# EasyEDA Pro project EdgeFouce_云台及电源管理.eprj, schematic Schematic1, sheets 1 to 4 of 5

## Sheets
1 STM32G431RBT6外围电路: Board Name: Board1; Create Date: 2026-06-02; Page Name: STM32G431RBT6外围电路; Project Name: EdgeFouce_云台及电源管理; Schematic Name: Schematic1; Update Date: 2026-06-02; Company: 嘉立创EDA; Page Size: A3; Version: V1.0
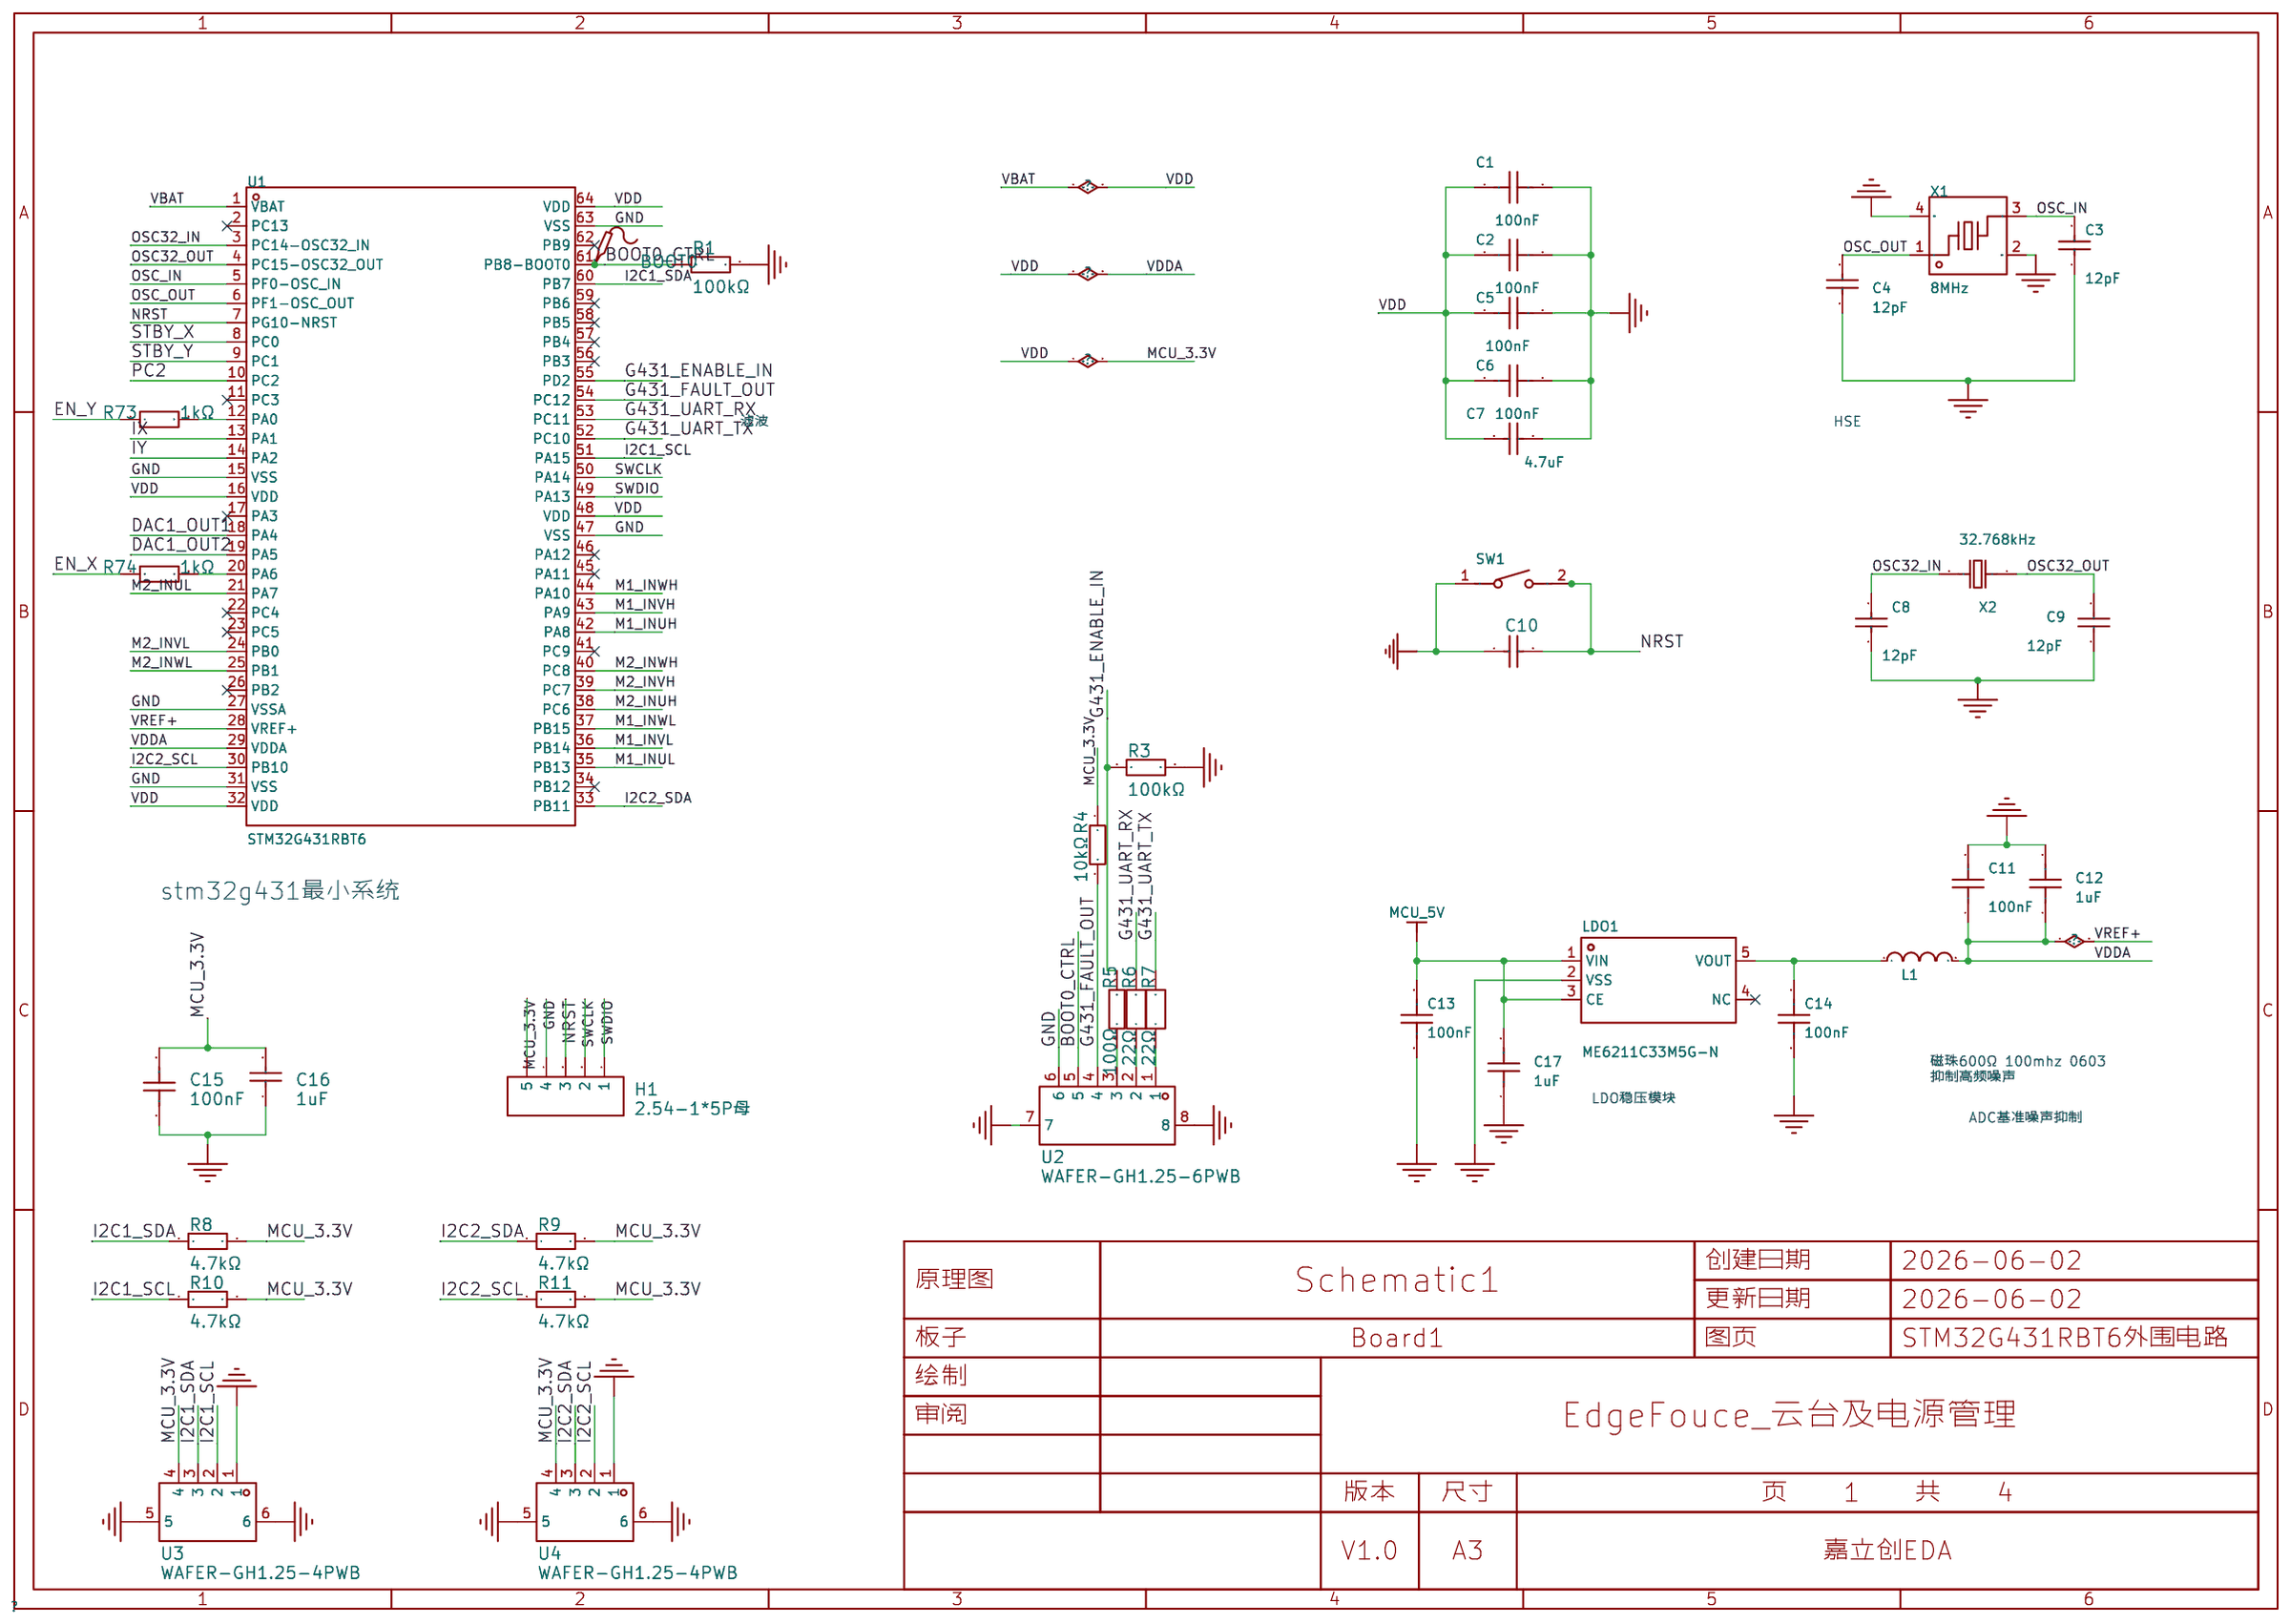
[diagram p0: STM32G431RBT6外围电路]
2 STPIN830电机驱动电路: Page Name: STPIN830电机驱动电路
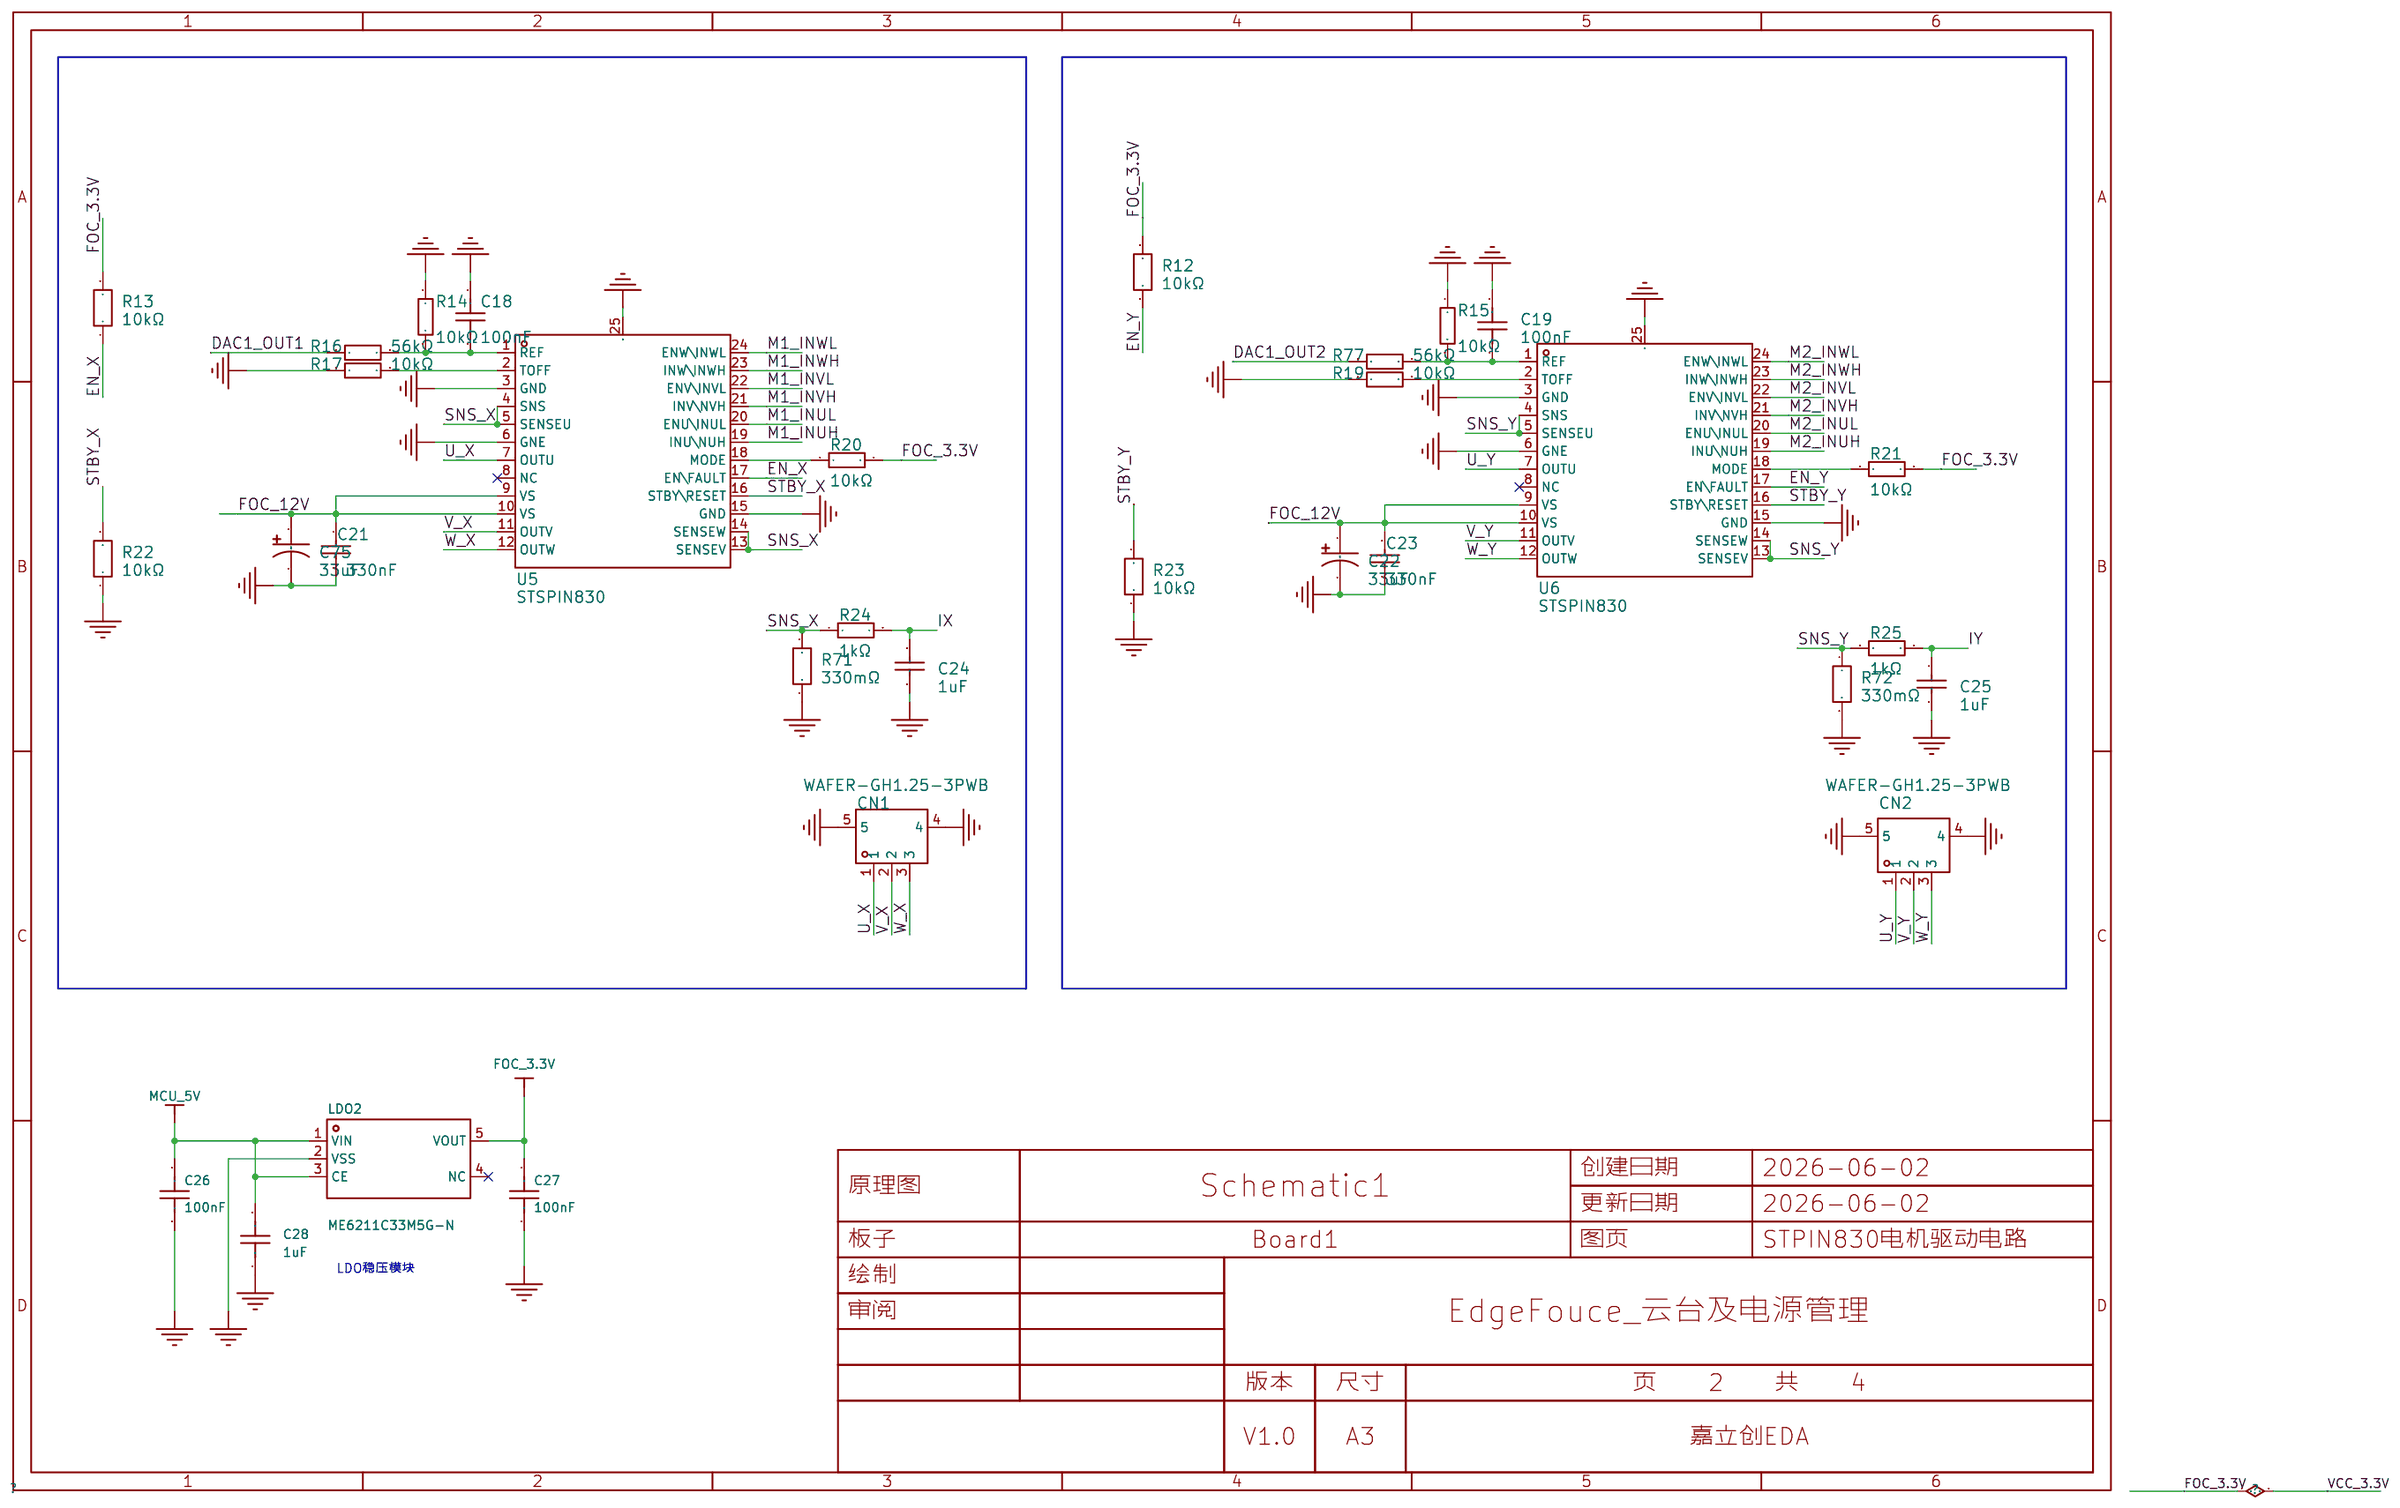
[diagram p1: STPIN830电机驱动电路]
3 PD取电: Page Name: PD取电
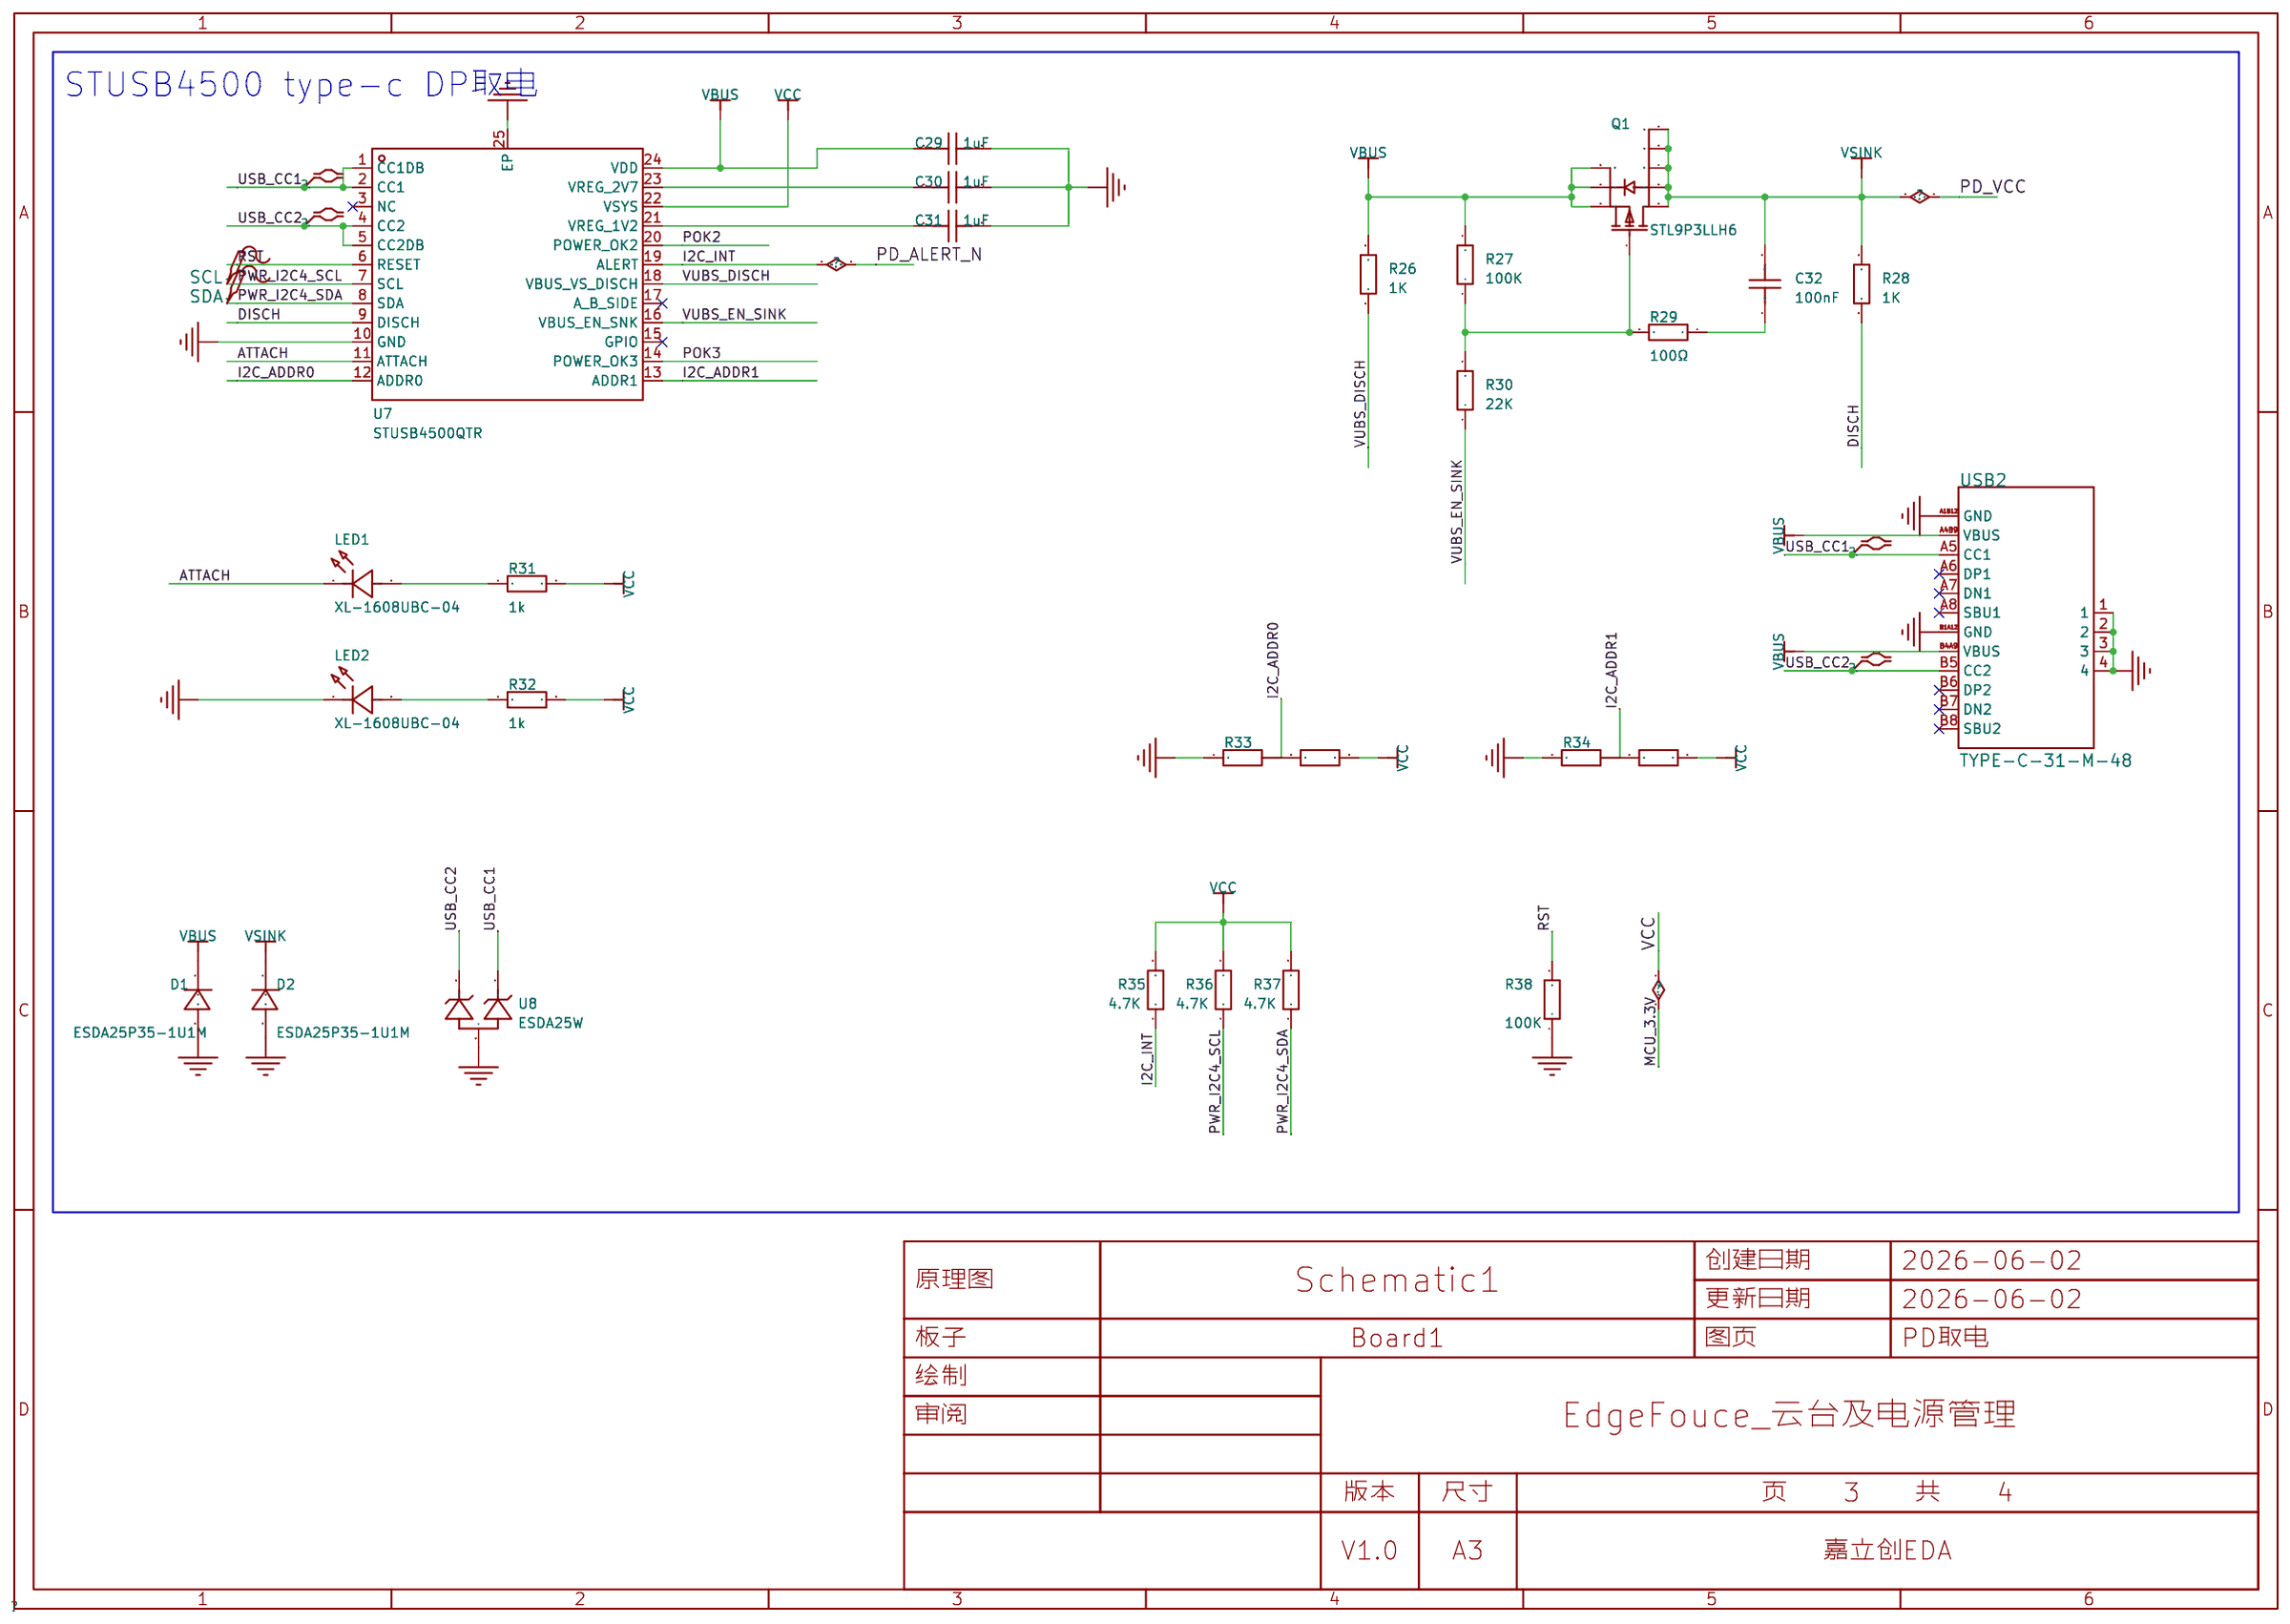
[diagram p2: PD取电]
4 充电及电源: Page Name: 充电及电源切换
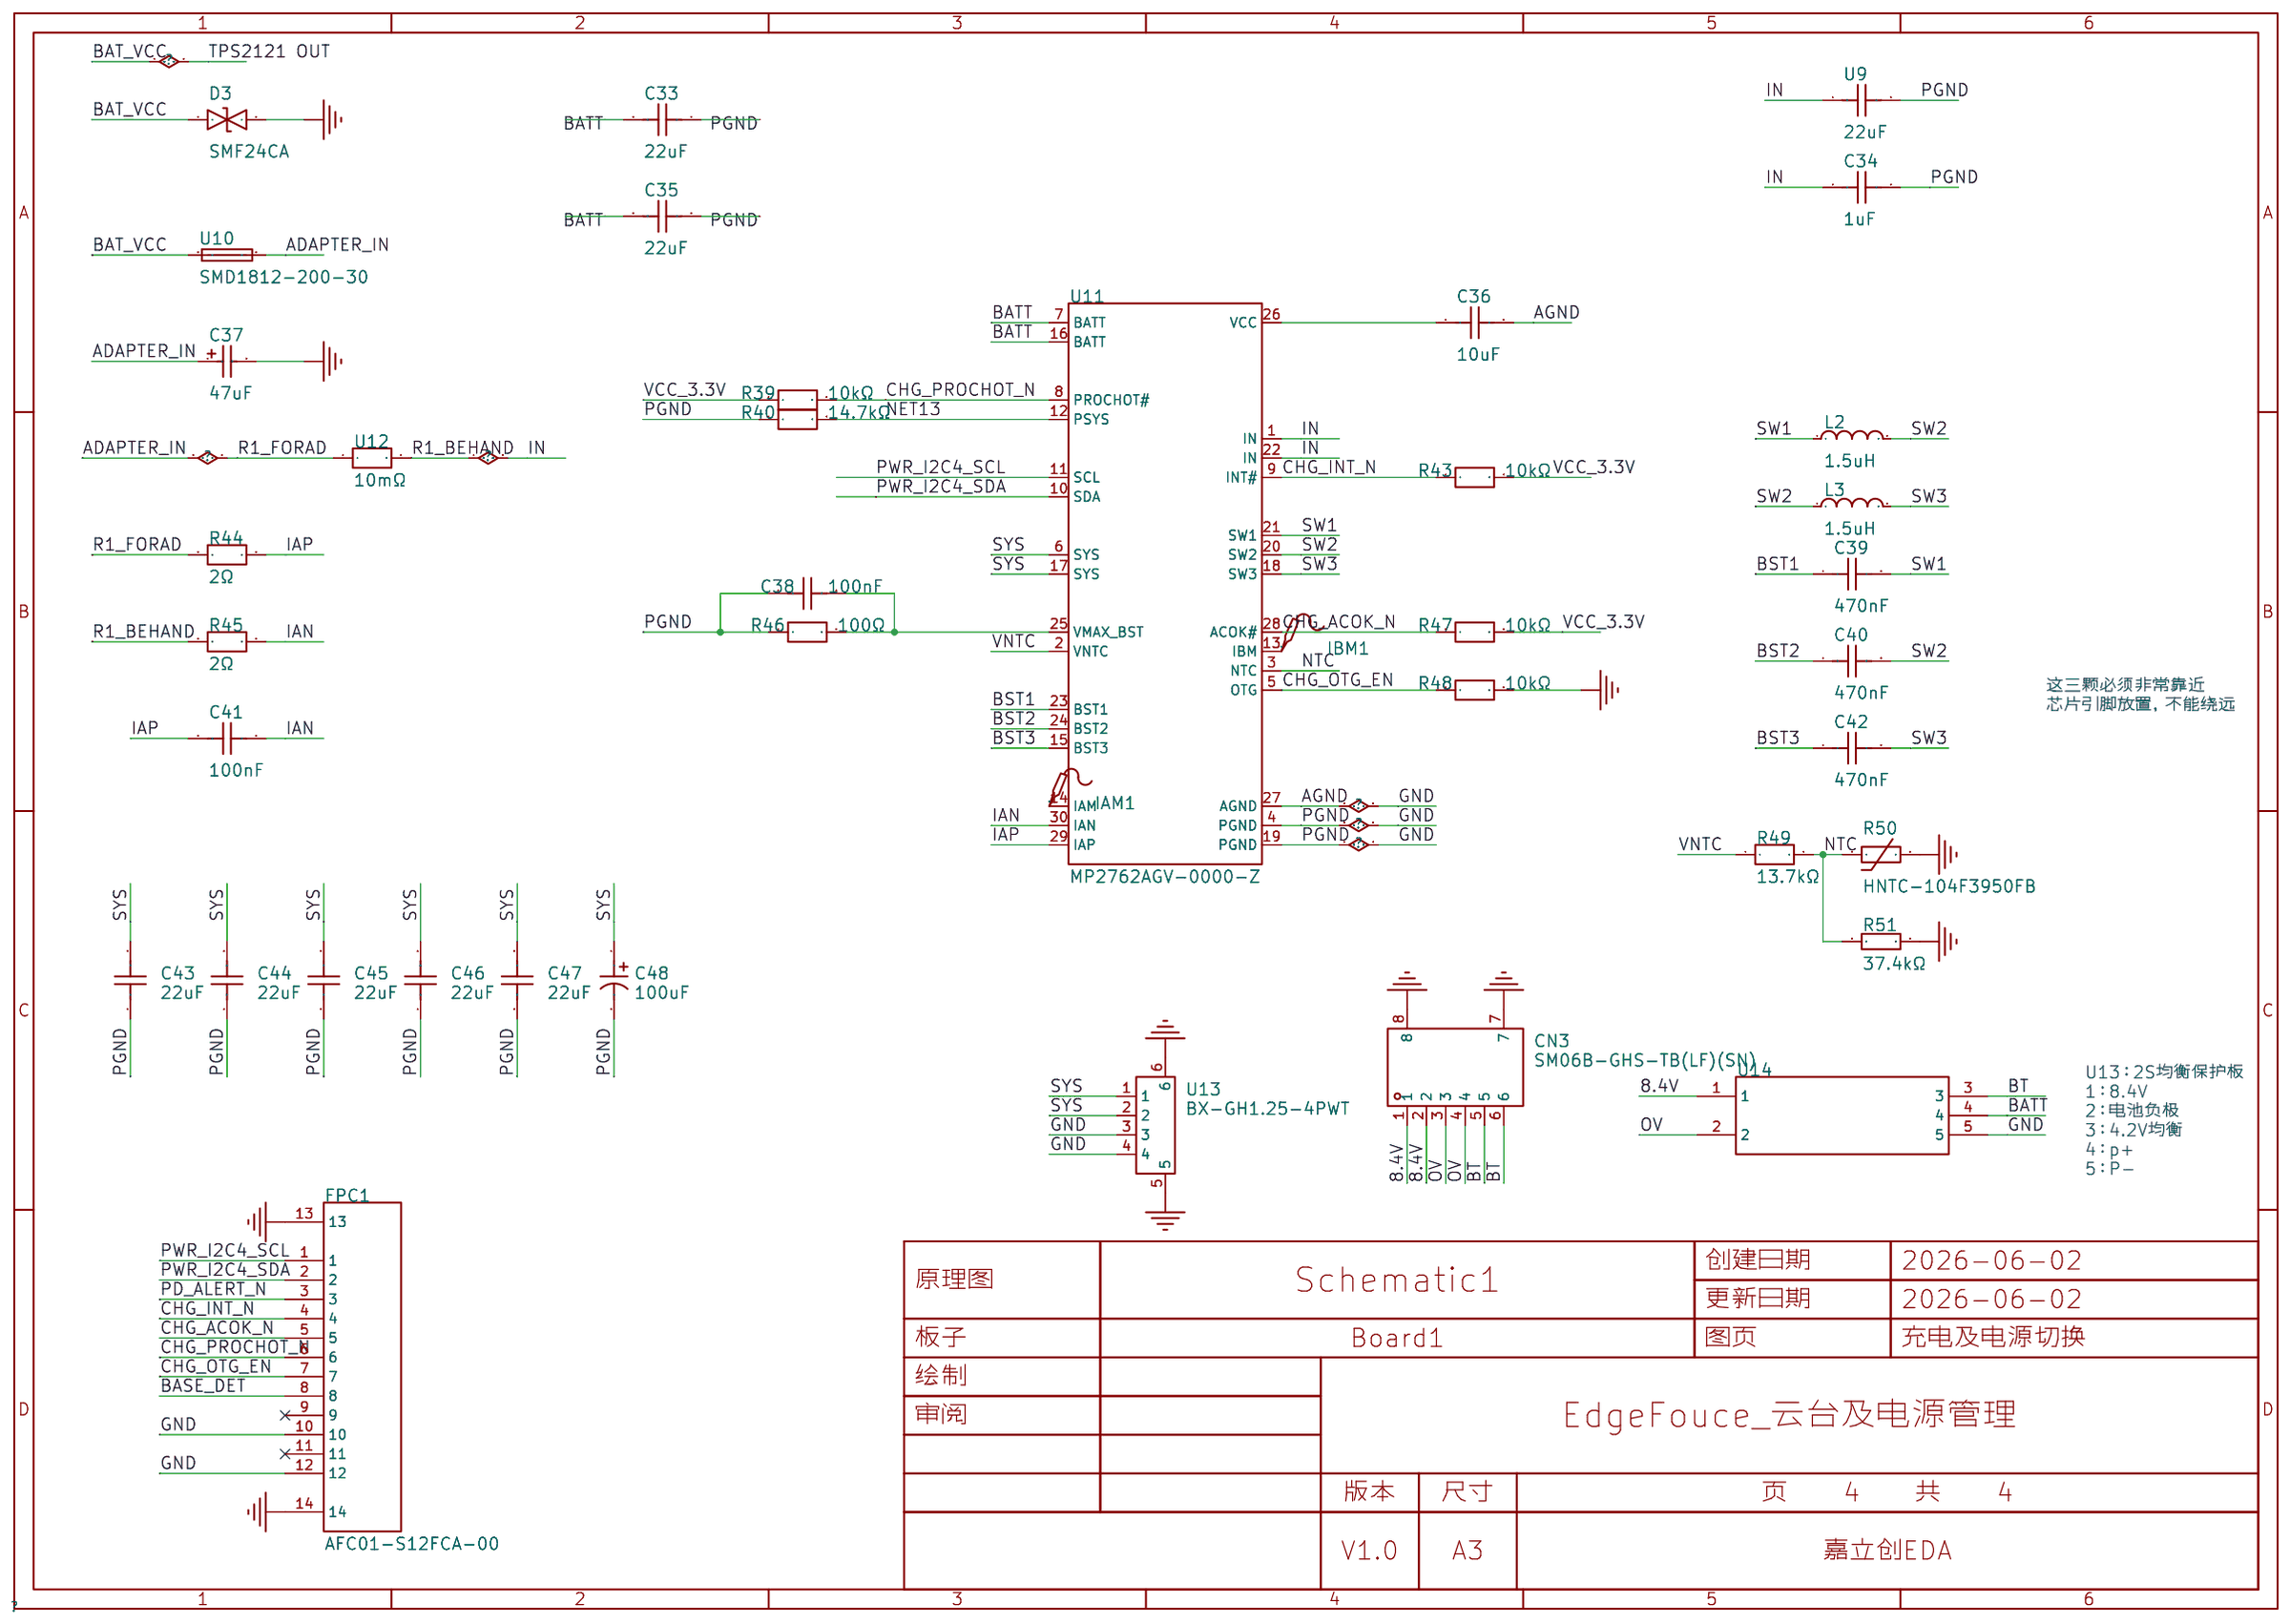
[diagram p3: 充电及电源]

## Parts
sheet PD取电
?#1  -
?#2  -
?#3  -
?#4  -
C29  1uF  [C0603]
C30  1uF  [C0603]
C31  1uF  [C0603]
C32  100nF  [C0603]
D1  ESDA25P35-1U1M  [DFN1610-2_L1.6-W1.0-P1.05-RD]
D2  ESDA25P35-1U1M  [DFN1610-2_L1.6-W1.0-P1.05-RD]
LED1  XL-1608UBC-04  [LED0603-RD_BLUE]
LED2  XL-1608UBC-04  [LED0603-RD_BLUE]
Q1  STL9P3LLH6  [PDFN3333-8L_L3.2-W3.0-P0.65-LS3.3-BL_WILLSEMI_WNM3057XXXX]
R26  1K  [R0603]
R27  100K  [R0603]
R28  1K  [R0603]
R29  100Ω  [R0603]
R30  22K  [R0603]
R31  1k  [R0603]
R32  1k  [R0603]
R33  -  [0603*2]
R34  -  [0603*2]
R35  4.7K  [R0603]
R36  4.7K  [R0603]
R37  4.7K  [R0603]
R38  100K  [R0603]
SCL  -  [Test-Point-0.5mm]
SDA  -  [Test-Point-0.5mm]
U7  STUSB4500QTR  [QFN-24_L4.0-W4.0-P0.50-BL-EP2.8]
U8  ESDA25W  [SOT-323-3_L2.1-W1.3-P1.32-LS2.1-BR]
USB2  TYPE-C-31-M-48  [USB-TYPE-C-SMD_TYPE-C-31-M-48]
sheet STM32G431RBT6外围电路
BOOT0  -  [Test-Point-0.5mm]
C1  100nF  [C0603]
C2  100nF  [C0603]
C3  12pF  [C0603]
C4  12pF  [C0603]
C5  100nF  [C0603]
C6  100nF  [C0603]
C7  4.7uF  [C0603]
C8  12pF  [C0603]
C9  12pF  [C0603]
C10  100nF  [C0603]
C11  100nF  [C0603]
C12  1uF  [C0603]
C13  100nF  [C0603]
C14  100nF  [C0603]
C15  100nF  [CAP-SMD_L2.0-W1.25]
C16  1uF  [C0805]
C17  1uF  [C0603]
H1  2.54-1*5P母  [HDR-TH_5P-P2.54-V-F]
L1  BLM18KG601SN1D  [L0603]
LDO1  ME6211C33M5G-N  [SOT-23-5_L3.0-W1.7-P0.95-LS2.8-BL]
R1  100kΩ  [R0805]
R3  100kΩ  [R0805]
R4  10kΩ  [R0805]
R5  100Ω  [R0805]
R6  22Ω  [R0805]
R7  22Ω  [R0805]
R8  4.7kΩ  [R0805]
R9  4.7kΩ  [R0805]
R10  4.7kΩ  [R0805]
R11  4.7kΩ  [R0805]
R73  1kΩ  [R0805]
R74  1kΩ  [R0805]
SW1  TS-1088-AR02016  [SW-SMD_L3.9-W3.0-P4.45]
U1  STM32G431RBT6  [LQFP-64_L10.0-W10.0-P0.50-LS12.0-BL]
U2  WAFER-GH1.25-6PWB  [CONN-SMD_6P-P1.25_XUNPU_WAFER-GH1.25-6PWB]
U3  WAFER-GH1.25-4PWB  [CONN-SMD_4P-P1.25_XUNPU_WAFER-GH1.25-4PWB]
U4  WAFER-GH1.25-4PWB  [CONN-SMD_4P-P1.25_XUNPU_WAFER-GH1.25-4PWB]
X1  8MHz  [OSC-SMD_4P-L3.2-W2.5-BL]
X2  32.768kHz  [FC-135R_L3.2-W1.5]
sheet STPIN830电机驱动电路
C18  100nF  [C0805]
C19  100nF  [C0805]
C21  330nF  [C0805]
C22  33uF  [CAP-SMD_L7.3-W4.3-FD]
C23  330nF  [C0805]
C24  1uF  [C0805]
C25  1uF  [C0805]
C26  100nF  [C0603]
C27  100nF  [C0603]
C28  1uF  [C0603]
C75  33uF  [CAP-SMD_L7.3-W4.3-FD]
CN1  WAFER-GH1.25-3PWB  [CONN-TH_3P-P1.25_GH1.25]
CN2  WAFER-GH1.25-3PWB  [CONN-TH_3P-P1.25_GH1.25]
LDO2  ME6211C33M5G-N  [SOT-23-5_L3.0-W1.7-P0.95-LS2.8-BL]
R12  10kΩ  [R0805]
R13  10kΩ  [R0805]
R14  10kΩ  [R0805]
R15  10kΩ  [R0805]
R16  56kΩ  [R0805]
R17  10kΩ  [R0805]
R19  10kΩ  [R0805]
R20  10kΩ  [R0805]
R21  10kΩ  [R0805]
R22  10kΩ  [R0805]
R23  10kΩ  [R0805]
R24  1kΩ  [R0805]
R25  1kΩ  [R0805]
R71  330mΩ  [R2512]
R72  330mΩ  [R2512]
R77  56kΩ  [R0805]
U5  STSPIN830  [TQFN-24_L4.0-W4.0-P0.50-BL-EP2.6]
U6  STSPIN830  [TQFN-24_L4.0-W4.0-P0.50-BL-EP2.6]
sheet 充电及电源
C33  22uF  [C0805]
C34  1uF  [C0603]
C35  22uF  [C0805]
C36  10uF  [C0603]
C37  47uF  [CAP-SMD_L7.3-W4.3-FD]
C38  100nF  [CAP-SMD_L2.0-W1.25]
C39  470nF  [C0603]
C40  470nF  [C0603]
C41  100nF  [C0603]
C42  470nF  [C0603]
C43  22uF  [C0805]
C44  22uF  [C0805]
C45  22uF  [C0805]
C46  22uF  [C0805]
C47  22uF  [C0805]
C48  100uF  [CAP-SMD_L7.3-W4.3-L-FD]
CN3  SM06B-GHS-TB(LF)(SN)  [CONN-TH_SM06B-GHS-TB-LF-SN]
D3  SMF24CA  [SOD-123FL_L2.7-W1.8-LS3.8-BI]
FPC1  AFC01-S12FCA-00  [FPC-SMD_AFC01-S12FCA-00]
IAM1  -  [Test-Point-0.5mm]
IBM1  -  [Test-Point-0.5mm]
L2  1.5uH  [IND-SMD_L7.5-W6.6_GSM0650]
L3  1.5uH  [IND-SMD_L7.5-W6.6_GSM0650]
R39  10kΩ  [R0805]
R40  14.7kΩ  [R0805]
R43  10kΩ  [R0805]
R44  2Ω  [R0603]
R45  2Ω  [R0603]
R46  100Ω  [R0805]
R47  10kΩ  [R0805]
R48  10kΩ  [R0805]
R49  13.7kΩ  [R0603]
R50  HNTC-104F3950FB  [RES-TH_BD2.5-P2.00_HNTC-103F3470FB]
R51  37.4kΩ  [R0603]
U9  22uF  [C0805]
U10  SMD1812-200-30  [F1812]
U11  MP2762AGV-0000-Z  [QFN-30_L5.0-W4.0-P0.50-TL_MP2762A]
U12  10mΩ  [R2512]
U13  BX-GH1.25-4PWT  [CONN-SMD_4P-P1.25_BX-GH1.25-4PWT]
U14  -  [2S均衡保护板]

## Library data of the parts
?#1-?#4 = Differential-Pairs-Flag
C29-C32 = CAP_0603: Supplier Footprint: 0603
D1 D2 = ESDA25P35-1U1M: 反向截止电压(Vrwm):22V;最大钳位电压:41V;峰值脉冲电流(Ipp)@10/1000us:35A@(8/20us);峰值脉冲功率(Ppp)@10/1000us:1.4kW;击穿电压:23.3V;; Supplier Part: C1974707; Manufacturer: ST(意法半导体); Supplier Footprint: DFN1610-2; JLCPCB Part Class: Extended Part; Datasheet: https://atta.szlcsc.com/upload/public/pdf/source/20210601/49D034E3356B5DC05DB33530BEA776A7.pdf; Supplier: LCSC; Reverse Stand-Off Voltage (Vrwm): 22V; Maximum Clamping Voltage: 41V; Peak Pulse Current (Ipp)@10/1000us: 35A@(8/20us); Peak Pulse Power Dissipation (Ppp)@10/1000us: 1.4kW; Breakdown Voltage: 23.3V; Number of Lines: 单路; Operating Temperature: -55℃~+150℃@(Tj); Type: ESD
LED1 LED2 = XL-1608UBC-04: 灯头类型:-;发光颜色:蓝色;正向压降(Vf):3.3V;功率:70mW;正向电流:20mA;波长:455nm~475nm;二极管配置:-;透镜颜色:无色透明透镜;色温:-;发光强度:300mcd;发光角度:120°;载带方式:正贴;工作温度:-20℃~+85℃;; Supplier Part: C965807; Manufacturer: XINGLIGHT(成兴光); Supplier Footprint: 0603; JLCPCB Part Class: Extended Part; Datasheet: https://atta.szlcsc.com/upload/public/pdf/source/20250213/9D28F40E58C3285D8CA3C7212E2FBA3B.pdf; Supplier: LCSC; Illumination Color: 蓝色; Voltage - Forward(Vf): 3.3V; Power(Watts): 70mW; Forward Current: 20mA; Wavelength - Dominant: 455nm~475nm; Peak Wavelength: 470nm; Lens Color: 无色透明透镜; Luminous Intensity: 300mcd; Viewing Angle: 120°; Mounting Sytle: 正贴; Operating Temperature: -20℃~+85℃
Q1 = STL9P3LLH6: 类型:1个P沟道;漏源电压(Vdss):30V;连续漏极电流(Id):9A;导通电阻(RDS(on)@Vgs,Id):15mΩ@10V,4.5A;功率(Pd):3W;阈值电压(Vgs(th)@Id):1V@250uA;; LCSC Part Name: 1个P沟道 耐压:30V 电流:9A; Supplier Part: C2969828; Manufacturer: ST(意法半导体); Supplier Footprint: PowerFLAT(3.3x3.3); JLCPCB Part Class: Extended Part; Datasheet: https://atta.szlcsc.com/upload/public/pdf/source/20221107/2CEBA4783858535D69B71314CA0579B7.pdf; Supplier: LCSC; Type: 1个P沟道; Drain Source Voltage (Vdss): 30V; Continuous Drain Current (Id): 9A; Drain Source On Resistance (RDS(on)@Vgs,Id): 15mΩ@10V,4.5A; Power Dissipation (Pd): 3W; Gate Threshold Voltage (Vgs(th)@Id): 1V@250uA; Total Gate Charge (Qg@Vgs): 24nC@15V; Input Capacitance (Ciss@Vds): 2.615nF@25V; Reverse Transfer Capacitance (Crss@Vds): 235pF; Operating Temperature: -55℃~+150℃
R26-R32 R35-R38 = Res_0603: Supplier Footprint: 0603
R33 R34 = 双选0欧电阻: JLCPCB Part Class: 扩展库
BOOT0 IAM1 IBM1 SCL SDA = Test-Point: Test Point 测试点
U7 = STUSB4500QTR: 应用功能:控制器;接口协议:PD 2.0；PD 3.0;; LCSC Part Name: 独立USB PD接收控制器，具有短路到VBUS保护功能; Supplier Part: C2678061; Manufacturer: ST(意法半导体); Supplier Footprint: QFN-24-EP(4x4); JLCPCB Part Class: Extended Part; Datasheet: https://atta.szlcsc.com/upload/public/pdf/source/20210606/33E93DD86F9F99EDBAF86753A743013D.pdf; Supplier: LCSC; Applications Function: 控制器; Protocol: PD 2.0；PD 3.0; Supply Voltage: 3V；5.5V; Operating Temperature: -40℃~+105℃
U8 = ESDA25W: 反向截止电压(Vrwm):24V;最大钳位电压:25V;峰值脉冲功率(Ppp):400W;击穿电压:25V;; Supplier Part: C2935152; Manufacturer: ST(意法半导体); Supplier Footprint: SOT-323-3L; JLCPCB Part Class: Extended Part; Datasheet: https://atta.szlcsc.com/upload/public/pdf/source/20150504/1457707285209.pdf; Supplier: LCSC; Reverse Stand-Off Voltage (Vrwm): 24V; Maximum Clamping Voltage: 25V; Peak Pulse Power Dissipation (Ppp): 400W; Breakdown Voltage: 25V; Number of Lines: 双路; Operating Temperature: -40℃~+125℃@(Tj); Type: ESD
USB2 = TYPE-C-31-M-48: 连接器类型:Type-C;公母:-;安装方式:卧贴;触点数量:16P;端口数量:1;额定电流 - 电源:5A;工作温度:-30℃~+85℃;; LCSC Part Name: Type-C 卧贴; Supplier Part: C47817612; Manufacturer: 韩国韩荣; Supplier Footprint: SMD; JLCPCB Part Class: Extended Part; Datasheet: https://item.szlcsc.com/datasheet/TYPE-C-31-M-48/50052992.html; Supplier: LCSC; Connector Type: Type-C; Mounting Type: 卧贴; Number of Contacts: 16P; Number of Ports: 1; Current Rating-Power: 5A; Voltage Rating: 20V; Connect-Disconnect Life: 1万次; Length: 10mm; Operating Temperature: -30℃~+85℃
C1 C2 C5 C6 C11 C13 C14 C26 C27 = CGA0603X7R104K500JT: 容值:100nF;精度:±10%;额定电压:50V;材质(温度系数):X7R;; LCSC Part Name: 100nF ±10% 50V; Supplier Part: C6119867; Manufacturer: HRE(芯声); Supplier Footprint: 0603; JLCPCB Part Class: 扩展库; Supplier: LCSC; Tolerance: ±10%; Voltage Rated: 50V; Temperature Coefficient: X7R
C3 C4 C8 C9 = CL10C120JB8NNNC: 容值:12pF;精度:±5%;额定电压:50V;材质(温度系数):C0G;; LCSC Part Name: 12pF ±5% 50V; Supplier Part: C38523; Manufacturer: SAMSUNG(三星); Supplier Footprint: 0603; JLCPCB Part Class: 基础库; Datasheet: https://atta.szlcsc.com/upload/public/pdf/source/20160218/1457707763339.pdf; Supplier: LCSC; Tolerance: ±5%; Voltage Rated: 50V; Temperature Coefficient: C0G
C7 = CL10A475KO8NNNC: 容值:4.7uF;精度:±10%;额定电压:16V;材质(温度系数):X5R;; LCSC Part Name: 4.7uF ±10% 16V; Supplier Part: C19666; Manufacturer: SAMSUNG(三星); Supplier Footprint: 0603; JLCPCB Part Class: 基础库; Datasheet: https://atta.szlcsc.com/upload/public/pdf/source/20160218/1457707763339.pdf; Supplier: LCSC; Tolerance: ±10%; Voltage Rated: 16V; Temperature Coefficient: X5R
C10 = 100nF: link: https://item.szlcsc.com/362304.html; 3DModel: C0603_L1.6-W0.8-H0.8; Supplier: LCSC; Manufacturer: FH(风华); Manufacturer Part: 0603B104K500NT; Supplier Part: C30926; JLCPCB Part Class: ExtendedPart
C12 = CGA0603X5R105K500JT: 容值:1uF;精度:±10%;额定电压:50V;材质(温度系数):X5R;; LCSC Part Name: 1uF ±10% 50V; Supplier Part: C6119852; Manufacturer: HRE(芯声); Supplier Footprint: 0603; JLCPCB Part Class: 扩展库; Supplier: LCSC; Tolerance: ±10%; Voltage Rated: 50V; Temperature Coefficient: X5R
C15 C38 = FCC0805B104K500DT: 容值:100nF;精度:±10%;额定电压:50V;温度系数:X7R;; LCSC Part Name: 100nF ±10% 50V; Supplier Part: C5137467; Manufacturer: FOJAN(富捷); Supplier Footprint: 0805; JLCPCB Part Class: Extended Part; Datasheet: https://item.szlcsc.com/datasheet/FCC0805B104K500DT/5746969.html; Supplier: LCSC; Tolerance: ±10%; Voltage Rating: 50V; Temperature Coefficient: X7R
C16 = CL21B105KBFNNNE: 容值:1uF;精度:±10%;额定电压:50V;温度系数:X7R;; LCSC Part Name: 1uF ±10% 50V; Supplier Part: C28323; Manufacturer: SAMSUNG(三星); Supplier Footprint: 0805; JLCPCB Part Class: Basic Part; Datasheet: https://item.szlcsc.com/datasheet/CL21B105KBFNNNE/29074.html; Supplier: LCSC; Tolerance: ±10%; Voltage Rating: 50V; Temperature Coefficient: X7R
C17 C28 = CL10A105KB8NNNC: 容值:1uF;精度:±10%;额定电压:50V;材质(温度系数):X5R;; LCSC Part Name: 1uF ±10% 50V; Supplier Part: C15849; Manufacturer: SAMSUNG(三星); Supplier Footprint: 0603; JLCPCB Part Class: 基础库; Datasheet: https://atta.szlcsc.com/upload/public/pdf/source/20160218/1457707763339.pdf; Supplier: LCSC; Tolerance: ±10%; Voltage Rated: 50V; Temperature Coefficient: X5R
H1 = 2.54-1*5P母: 插孔结构:1x5P;间距:2.54mm;行距:-;圆孔/方孔:方孔;安装方式:直插;排数:单排;总孔位数:5P;额定电流:3A;插孔方向:顶部;塑高:8.5mm;触头材质:黄铜;触头镀层:金;工作温度:-55℃~+105℃;; LCSC Part Name: 1x5P 间距:2.54mm 直插; Supplier Part: C50950; Manufacturer: BOOMELE(博穆精密); Supplier Footprint: 插件,P=2.54mm; JLCPCB Part Class: Extended Part; Datasheet: https://item.szlcsc.com/datasheet/2.54-1*5P%25E6%25AF%258D/51962.html; Supplier: LCSC; Holes Structure: 1x5P; Pitch: 2.54mm; Circular Hole / Square Hole: 方孔; Mounting Type: 直插; Number of Rows: 单排; Number of Positions: 5P; Current Rating: 3A; Holes Direction: 顶部; Insulation Height: 8.5mm; Contact Material: 黄铜; Contact Plating: 金; Operating Temperature: -55℃~+105℃; PIN Length: 3.2mm
L1 = BLM18KG601SN1D: 标称阻抗@测试频率:600Ω@100MHz;误差:±25%;直流电阻(RDC):150mΩ;; LCSC Part Name: 单路 0603磁珠 阻抗600Ω@100MHz; Supplier Part: C85833; Manufacturer: muRata(村田); Supplier Footprint: 0603; JLCPCB Part Class: 扩展库; Datasheet: https://atta.szlcsc.com/upload/public/pdf/source/20180329/C160981_FD3C2D2622A377E203B89F4AA32B0741.pdf; Supplier: LCSC; Impedance @ Frequency: 600Ω@100MHz; Tolerance: ±25%; DC Resistance: 150mΩ; Current Rating: 1.3A; Circuits: 1
LDO1 LDO2 = ME6211C33M5G-N: 输出类型:固定;最大输入电压:6V;输出电压:3.3V;最大输出电流:500mA;电源纹波抑制比(PSRR):70dB;输出极性:正极;; LCSC Part Name: 输入6V 输出3.3V 500mA; Supplier Part: C82942; Manufacturer: MICRONE(南京微盟); Supplier Footprint: SOT-23-5; JLCPCB Part Class: 扩展库; Datasheet: https://atta.szlcsc.com/upload/public/pdf/source/20170918/C82942_1505727073070976520.pdf; Supplier: LCSC; Output Type: 固定; Maximum Input Voltage: 6V; Output Voltage: 3.3V; MAX Output Current: 500mA; Power Supply Rejection Ratio (PSRR): 70dB; Dropout Voltage: 260mV@(200mA); Output Polarity: 正极; Number of Outputs: 1
R1 R3 = 0805W8F1003T5E: 电阻类型:厚膜电阻;阻值:100kΩ;精度:±1%;功率:125mW;工作电压:150V;温度系数:±100ppm/℃;; LCSC Part Name: 100kΩ ±1% 125mW 厚膜电阻; Supplier Part: C149504; Manufacturer: UNI-ROYAL(厚声); Supplier Footprint: 0805; JLCPCB Part Class: Basic Part; Datasheet: https://item.szlcsc.com/datasheet/0805W8F1003T5E/160838.html; Supplier: LCSC; Type: 厚膜电阻; Tolerance: ±1%; Power(Watts): 125mW; Voltage-Supply(Max): 150V; Temperature Coefficient: ±100ppm/℃; Operating Temperature: -55℃~+155℃
R4 R14 R15 R17 R19-R21 = 0805W8F1002T5E_C17414: 电阻类型:厚膜电阻;阻值:10kΩ;精度:±1%;功率:125mW;工作电压:150V;温度系数:±100ppm/℃;; LCSC Part Name: 10kΩ ±1% 125mW 厚膜电阻; Supplier Part: C17414; Manufacturer: UNI-ROYAL(厚声); Manufacturer Part: 0805W8F1002T5E; Supplier Footprint: 0805; JLCPCB Part Class: Basic Part; Datasheet: https://item.szlcsc.com/datasheet/0805W8F1002T5E/18102.html; Supplier: LCSC; Type: 厚膜电阻; Tolerance: ±1%; Power(Watts): 125mW; Voltage-Supply(Max): 150V; Temperature Coefficient: ±100ppm/℃; Operating Temperature: -55℃~+155℃
R5 = 0805W8F1000T5E: 电阻类型:厚膜电阻;阻值:100Ω;精度:±1%;功率:125mW;最大工作电压:150V;温度系数:±100ppm/℃;; LCSC Part Name: 100Ω ±1% 125mW 厚膜电阻; Supplier Part: C17408; Manufacturer: UNI-ROYAL(厚声); Supplier Footprint: 0805; JLCPCB Part Class: Basic Part; Datasheet: https://atta.szlcsc.com/upload/public/pdf/source/20200306/C422600_1E6D84923E4A46A82E41ADD87F860B5C.pdf; Supplier: LCSC; Type: 厚膜电阻; Tolerance: ±1%; Power(Watts): 125mW; Overload Voltage (Max): 150V; Temperature Coefficient: ±100ppm/℃; Operating Temperature Range: -55℃~+155℃
R6 R7 = FRC0805F22R0TS: 电阻类型:厚膜电阻;阻值:22Ω;精度:±1%;功率:125mW;工作电压:150V;温度系数:±100ppm/℃;; LCSC Part Name: 22Ω ±1% 125mW 厚膜电阻; Supplier Part: C2907244; Manufacturer: FOJAN(富捷); Supplier Footprint: 0805; JLCPCB Part Class: Extended Part; Datasheet: https://item.szlcsc.com/datasheet/FRC0805F22R0TS/3180757.html; Supplier: LCSC; Type: 厚膜电阻; Tolerance: ±1%; Power(Watts): 125mW; Voltage-Supply(Max): 150V; Temperature Coefficient: ±100ppm/℃; Operating Temperature: -55℃~+155℃
R8-R11 = 0805W8F4701T5E: 电阻类型:厚膜电阻;阻值:4.7kΩ;精度:±1%;功率:125mW;最大工作电压:150V;温度系数:±100ppm/℃;; LCSC Part Name: 4.7kΩ ±1% 125mW 厚膜电阻; Supplier Part: C17673; Manufacturer: UNI-ROYAL(厚声); Supplier Footprint: 0805; JLCPCB Part Class: Basic Part; Datasheet: https://atta.szlcsc.com/upload/public/pdf/source/20200306/C422600_1E6D84923E4A46A82E41ADD87F860B5C.pdf; Supplier: LCSC; Type: 厚膜电阻; Tolerance: ±1%; Power(Watts): 125mW; Overload Voltage (Max): 150V; Temperature Coefficient: ±100ppm/℃; Operating Temperature Range: -55℃~+155℃
R24 R25 R73 R74 = RT0805BRD071KL: 电阻类型:薄膜电阻;阻值:1kΩ;精度:±0.1%;功率:125mW;最大工作电压:150V;温度系数:±25ppm/℃;; LCSC Part Name: 薄膜电阻 1kΩ ±0.1% 125mW; Supplier Part: C110774; Manufacturer: YAGEO(国巨); Supplier Footprint: 0805; JLCPCB Part Class: Extended Part; Datasheet: https://atta.szlcsc.com/upload/public/pdf/source/20171026/C133380_15089840010201058857.pdf; Supplier: LCSC; Type: 薄膜电阻; Tolerance: ±0.1%; Power(Watts): 125mW; Overload Voltage (Max): 150V; Temperature Coefficient: ±25ppm/℃; Operating Temperature Range: -55℃~+155℃
SW1 = TS-1088-AR02016: 电路结构:单刀单掷;按钮形状:圆形按钮;作用力:160gf;安装方式:立贴;开关长度:4mm;开关宽度:3mm;开关高度:2mm;带支架:不带;触点电流:50mA;额定电压(DC):12V;绝缘电阻:100MΩ;机械寿命:10万次;; LCSC Part Name: 4*3*2mm 立贴 轻触开关; Supplier Part: C720477; Manufacturer: XUNPU(讯普); Supplier Footprint: SMD; JLCPCB Part Class: 扩展库; Datasheet: https://atta.szlcsc.com/upload/public/pdf/source/20200810/C720475_60D09DD6C54279ADDB2DC25100F1CC11.pdf; Supplier: LCSC; Circuit: 单刀单掷; Actuator Style: 圆形按钮; Operating Force: 160gf; Mounting Style: 立贴; Switch Length: 4mm; Switch Width: 3mm; Switch Height: 2mm; Strike Gundam: 不带; Contact Current: 50mA; Voltage Rating (DC): 12V; Insulation Resistance: 100MΩ; Actuator/Cap Color: 黑色; Pin Style: SMD接片; Mechanical Life: 10万次; Operating Temperature: -30℃~+80℃
U1 = STM32G431RBT6: CPU内核:-;程序存储容量:128KB;GPIO端口数量:52;工作电压范围:1.71V~3.6V;CPU最大主频:170MHz;; LCSC Part Name: 带DSP和FPU的170MHz主流ARM Cortex-M4 MCU，具有128 KB Flash存储器、数学加速器和中等模拟电平集成; Supplier Part: C431633; Manufacturer: ST(意法半导体); Supplier Footprint: LQFP-64(10x10); JLCPCB Part Class: 扩展库; Datasheet: https://atta.szlcsc.com/upload/public/pdf/source/20190925/C431633_8068E60CC825A086DCCD86A4BDED9458.pdf; Supplier: LCSC; Program Storage Size: 128KB; GPIO Ports Number: 52; Operating Voltage Range: 1.71V~3.6V; CPU Maximum Speed: 170MHz; Operating Temperature Range: -40℃~+85℃; ADC (Bit): 12bit; DAC (Bit): 12bit; Watchdog: 有; Infrared Data Association: 有; Low-Voltage Detect: 有; Direct Memory Access: 有; Internal Oscillator: 有
U2 = WAFER-GH1.25-6PWB: 插针结构:1x6P;间距:1.25mm;安装方式:卧贴;参考系列:GH;总PIN数:6P;排数:1;每排PIN数:6;行距:-;额定电流:1A;触头材质:黄铜;触头镀层:锡;工作温度:-25℃~+85℃;; LCSC Part Name: 1x6P 间距:1.25mm 卧贴 系列:GH; Supplier Part: C3029381; Manufacturer: XUNPU(讯普); Supplier Footprint: SMD,P=1.25mm,卧贴; JLCPCB Part Class: Extended Part; Datasheet: https://item.szlcsc.com/datasheet/WAFER-GH1.25-6PWB/3561393.html; Supplier: LCSC; Pins Structure: 1x6P; Pitch: 1.25mm; Mounting Type: 卧贴; Reference Series: GH; Number of Pins: 6P; Number of Rows: 1; Number of PINs Per Row: 6; Current Rating: 1A; Contact Material: 黄铜; Contact Plating: 锡; Operating Temperature: -25℃~+85℃; Voltage Rating: 125V; Plastic Material: LCP; Supplementary Features: 辅助焊脚; Color: 米色; Z-Height of the Board: 4.35mm; X-Length of Bottom Edge on Board (Spacing Line): 10.75mm; Y-Width of Bottom Edge on Board: 5mm
U3 U4 = WAFER-GH1.25-4PWB: 插针结构:1x4P;间距:1.25mm;安装方式:卧贴;参考系列:GH;总PIN数:4P;排数:1;每排PIN数:4;行距:-;额定电流:1A;触头材质:黄铜;触头镀层:锡;工作温度:-25℃~+85℃;; LCSC Part Name: 1x4P 间距:1.25mm 卧贴 系列:GH; Supplier Part: C3029379; Manufacturer: XUNPU(讯普); Supplier Footprint: SMD,P=1.25mm,卧贴; JLCPCB Part Class: Extended Part; Datasheet: https://item.szlcsc.com/datasheet/WAFER-GH1.25-4PWB/3561391.html; Supplier: LCSC; Pins Structure: 1x4P; Pitch: 1.25mm; Mounting Type: 卧贴; Reference Series: GH; Number of Pins: 4P; Number of Rows: 1; Number of PINs Per Row: 4; Current Rating: 1A; Contact Material: 黄铜; Contact Plating: 锡; Operating Temperature: -25℃~+85℃; Voltage Rating: 125V; Plastic Material: LCP; Supplementary Features: 辅助焊脚; Color: 米色; Z-Height of the Board: 4.35mm; X-Length of Bottom Edge on Board (Spacing Line): 8.25mm; Y-Width of Bottom Edge on Board: 5mm
X1 = X32258MOB4SI: 晶振类型:贴片晶振;频率:8MHz;常温频差:±10ppm;外接负载电容:12pF;频率稳定度(全温):±20ppm;; LCSC Part Name: 8MHz ±10ppm 12pF; Supplier Part: C2682775; Manufacturer: YXC(扬兴晶振); Supplier Footprint: SMD3225-4P; JLCPCB Part Class: 扩展库; Datasheet: https://atta.szlcsc.com/upload/public/pdf/source/20240329/19D5F850207469550BEB00D7DFEDBC7A.pdf; Supplier: LCSC; Crystal Type: 贴片晶振; Normal temperature Frequency Tolerance: ±10ppm; External load capacitor: 12pF; Frequency Stability(Full temperature range): ±20ppm; Equivalent Series Resistance (ESR): 150Ω; Operating Temperature: -40℃~+85℃
X2 = Q13FC13500004_C32346: 晶振类型:贴片晶振;频率:32.768kHz;常温频差:±20ppm;负载电容:12.5pF;; LCSC Part Name: 32.768kHz ±20ppm 12.5pF; Supplier Part: C32346; Manufacturer: EPSON(爱普生); Manufacturer Part: Q13FC13500004; Supplier Footprint: SMD3215-2P; JLCPCB Part Class: 基础库; Datasheet: https://atta.szlcsc.com/upload/public/pdf/source/20240418/0E0FF5F0356BA3753F616001439D1416.pdf; Supplier: LCSC; Crystal Type: 贴片晶振; Normal temperature Frequency Tolerance: ±20ppm; Load Capacitor: 12.5pF; Equivalent Series Resistance (ESR): 70kΩ; Operating Temperature: -40℃~+85℃
C18 C19 = CC0805KRX7R9BB104: 容值:100nF;精度:±10%;额定电压:50V;温度系数:X7R;; LCSC Part Name: 100nF ±10% 50V; Supplier Part: C49678; Manufacturer: YAGEO(国巨); Supplier Footprint: 0805; JLCPCB Part Class: Basic Part; Datasheet: https://item.szlcsc.com/datasheet/CC0805KRX7R9BB104/50686.html; Supplier: LCSC; Tolerance: ±10%; Voltage Rating: 50V; Temperature Coefficient: X7R
C21 C23 = CL21B334KBFNNNE: 容值:330nF;精度:±10%;额定电压:50V;温度系数:X7R;; LCSC Part Name: 330nF ±10% 50V; Supplier Part: C73142; Manufacturer: SAMSUNG(三星); Supplier Footprint: 0805; JLCPCB Part Class: Extended Part; Datasheet: https://item.szlcsc.com/datasheet/CL21B334KBFNNNE/74255.html; Supplier: LCSC; Tolerance: ±10%; Voltage Rating: 50V; Temperature Coefficient: X7R
C22 C75 = 25TQC33MYF: 容值:33uF;精度:±20%;额定电压:25V;等效串联电阻(ESR):60mΩ@100kHz;; LCSC Part Name: 33uF ±20% 25V MSL=3拆包后请尽快使用; Supplier Part: C191808; Manufacturer: PANASONIC(松下); Supplier Footprint: SMD,7.3x4.3mm; JLCPCB Part Class: Extended Part; Datasheet: https://item.szlcsc.com/datasheet/25TQC33MYF/217686.html; Supplier: LCSC; Tolerance: ±20%; Voltage Rating: 25V; Equivalent Series Resistance(ESR): 60mΩ@100kHz; Operating Temperature: -55℃~+105℃
C24 C25 = CC0805KKX7R9BB105: 容值:1uF;精度:±10%;额定电压:50V;材质(温度系数):X7R;; LCSC Part Name: 1uF ±10% 50V; Supplier Part: C91185; Manufacturer: YAGEO(国巨); Supplier Footprint: 0805; JLCPCB Part Class: Extended Part; Datasheet: https://atta.szlcsc.com/upload/public/pdf/source/20181008/C309510_22F155564471FAF6A489F7D68F34234E.pdf; Supplier: LCSC; Tolerance: ±10%; Voltage Rated: 50V; Temperature Coefficient: X7R
CN1 CN2 = WAFER-GH1.25-3PWB: 插针结构:1x3P;间距:1.25mm;安装方式:卧贴;参考系列:GH;总PIN数:3P;排数:1;每排PIN数:3;行距:-;额定电流:1A;触头材质:黄铜;触头镀层:锡;工作温度:-25℃~+85℃;; LCSC Part Name: 1x3P 间距:1.25mm 卧贴 系列:GH; Supplier Part: C3029378; Manufacturer: XUNPU(讯普); Supplier Footprint: SMD,P=1.25mm,卧贴; JLCPCB Part Class: Extended Part; Datasheet: https://item.szlcsc.com/datasheet/WAFER-GH1.25-3PWB/3561390.html; Supplier: LCSC; Pins Structure: 1x3P; Pitch: 1.25mm; Mounting Type: 卧贴; Reference Series: GH; Number of Pins: 3P; Number of Rows: 1; Number of PINs Per Row: 3; Current Rating: 1A; Contact Material: 黄铜; Contact Plating: 锡; Operating Temperature: -25℃~+85℃; Voltage Rating: 125V; Plastic Material: LCP; Supplementary Features: 辅助焊脚; Color: 米色; Z-Height of the Board: 4.35mm; X-Length of Bottom Edge on Board (Spacing Line): 7mm; Y-Width of Bottom Edge on Board: 5mm
R12 R13 R22 R23 R39 R43 R47 R48 = FRC0805J103TS: 电阻类型:厚膜电阻;阻值:10kΩ;精度:±5%;功率:125mW;工作电压:150V;温度系数:±100ppm/℃;; LCSC Part Name: 10kΩ ±5% 125mW 厚膜电阻; Supplier Part: C2930231; Manufacturer: FOJAN(富捷); Supplier Footprint: 0805; JLCPCB Part Class: Extended Part; Supplier: LCSC; Type: 厚膜电阻; Tolerance: ±5%; Power(Watts): 125mW; Voltage-Supply(Max): 150V; Temperature Coefficient: ±100ppm/℃; Operating Temperature: -55℃~+155℃
R16 R77 = RC0805FR-0756KL: 电阻类型:厚膜电阻;阻值:56kΩ;精度:±1%;功率:125mW;最大工作电压:150V;温度系数:±100ppm/℃;; LCSC Part Name: 厚膜电阻 56kΩ ±1% 125mW; Supplier Part: C137509; Manufacturer: YAGEO(国巨); Supplier Footprint: 0805; JLCPCB Part Class: Extended Part; Datasheet: https://atta.szlcsc.com/upload/public/pdf/source/20180821/C275644_0D56F95EFF785E7D9A1FEF436B37DA78.pdf; Supplier: LCSC; Type: 厚膜电阻; Tolerance: ±1%; Power(Watts): 125mW; Overload Voltage (Max): 150V; Temperature Coefficient: ±100ppm/℃; Operating Temperature Range: -55℃~+155℃
R71 R72 = RE2512F2R330: 电阻类型:合金电阻;阻值:330mΩ;精度:±1%;功率:2W;安装方式:贴片;; LCSC Part Name: 330mΩ 2W 2512 ±1%; Supplier Part: C52033635; Manufacturer: JIERR(捷而瑞); Supplier Footprint: 2512; JLCPCB Part Class: Extended Part; Datasheet: https://item.szlcsc.com/datasheet/RE2512F2R330/54788136.html; Supplier: LCSC; Type: 合金电阻; Tolerance: ±1%; Power(Watts): 2W; Mounting Type: 贴片
U5 U6 = STSPIN830: 紧凑型通用三相三路感应BLDC电机驱动器; Supplier Part: C503310; Manufacturer: ST(意法半导体); Supplier Footprint: TQFPN-24(4x4); JLCPCB Part Class: Extended Part; Datasheet: https://atta.szlcsc.com/upload/public/pdf/source/20200407/C503310_6CB99BBEFBCC46BC31F5A26582706581.pdf; Supplier: LCSC
C33 C35 C43-C47 = CGA0805X5R226M250MT: 容值:22uF;精度:±20%;额定电压:25V;温度系数:X5R;; LCSC Part Name: 22uF ±20% 25V; Supplier Part: C6119899; Manufacturer: HRE(芯声); Supplier Footprint: 0805; JLCPCB Part Class: Extended Part; Datasheet: https://item.szlcsc.com/datasheet/CGA0805X5R226M250MT/7062605.html; Supplier: LCSC; Tolerance: ±20%; Voltage Rating: 25V; Temperature Coefficient: X5R
C34 = CGA0603X5R105K500JT: 容值:1uF;精度:±10%;额定电压:50V;温度系数:X5R;; LCSC Part Name: 1uF ±10% 50V; Supplier Part: C6119852; Manufacturer: HRE(芯声); Supplier Footprint: 0603; JLCPCB Part Class: Extended Part; Datasheet: https://item.szlcsc.com/datasheet/CGA0603X5R105K500JT/7062558.html; Supplier: LCSC; Tolerance: ±10%; Voltage Rating: 50V; Temperature Coefficient: X5R
C36 = CGA0603X5R106K100JT: 容值:10uF;精度:±10%;额定电压:10V;温度系数:X5R;; LCSC Part Name: 10uF ±10% 10V; Supplier Part: C6119842; Manufacturer: HRE(芯声); Supplier Footprint: 0603; JLCPCB Part Class: Extended Part; Datasheet: https://item.szlcsc.com/datasheet/CGA0603X5R106K100JT/7062548.html; Supplier: LCSC; Tolerance: ±10%; Voltage Rating: 10V; Temperature Coefficient: X5R
C37 = T491X476K035AT: 容值:47uF;精度:±10%;额定电压:35V;等效串联电阻(ESR):600mΩ@100kHz;; LCSC Part Name: 47uF ±10% 35V; Supplier Part: C87110; Manufacturer: KEMET(基美); Supplier Footprint: CASE-X-7343-43(mm); JLCPCB Part Class: Extended Part; Datasheet: https://item.szlcsc.com/datasheet/T491X476K035AT/88288.html; Supplier: LCSC; Tolerance: ±10%; Voltage Rating: 35V; Equivalent Series Resistance(ESR): 600mΩ@100kHz; Operating Temperature: -55℃~+125℃
C39 C40 C42 = CC0603KRX7R9BB474: 容值:470nF;精度:±10%;额定电压:50V;温度系数:X7R;; LCSC Part Name: 470nF ±10% 50V; Supplier Part: C513577; Manufacturer: YAGEO(国巨); Supplier Footprint: 0603; JLCPCB Part Class: Extended Part; Datasheet: https://item.szlcsc.com/datasheet/CC0603KRX7R9BB474/528404.html; Supplier: LCSC; Tolerance: ±10%; Voltage Rating: 50V; Temperature Coefficient: X7R
C41 = CGA0603X7R104K500JT: 容值:100nF;精度:±10%;额定电压:50V;温度系数:X7R;; LCSC Part Name: 100nF ±10% 50V; Supplier Part: C6119867; Manufacturer: HRE(芯声); Supplier Footprint: 0603; JLCPCB Part Class: Extended Part; Datasheet: https://item.szlcsc.com/datasheet/CGA0603X7R104K500JT/7062573.html; Supplier: LCSC; Tolerance: ±10%; Voltage Rating: 50V; Temperature Coefficient: X7R
C48 = TAJD107K016SNJ: 容值:100uF;精度:±10%;额定电压:16V;等效串联电阻(ESR):600mΩ;; LCSC Part Name: 100uF ±10% 16V; Supplier Part: C1952982; Manufacturer: Kyocera AVX; Supplier Footprint: 2917; JLCPCB Part Class: Extended Part; Supplier: LCSC; Tolerance: ±10%; Voltage Rating: 16V; Equivalent Series Resistance(ESR): 600mΩ; Operating Temperature: -55℃~+125℃
CN3 = SM06B-GHS-TB(LF)(SN): 插针结构:1x6P;间距:1.25mm;安装方式:卧贴;参考系列:GH;总PIN数:6P;排数:1;每排PIN数:6;行距:-;额定电流:1A;触头材质:磷青铜;触头镀层:锡;工作温度:-25℃~+85℃;; LCSC Part Name: 1x6P 间距:1.25mm 卧贴 系列:GH; Supplier Part: C133065; Manufacturer: JST; Supplier Footprint: SMD,P=1.25mm,卧贴; JLCPCB Part Class: Extended Part; Datasheet: https://item.szlcsc.com/datasheet/SM06B-GHS-TB(LF)(SN)/144367.html; Supplier: LCSC; Pins Structure: 1x6P; Pitch: 1.25mm; Mounting Type: 卧贴; Reference Series: GH; Number of Pins: 6P; Number of Rows: 1; Number of PINs Per Row: 6; Current Rating: 1A; Contact Material: 磷青铜; Contact Plating: 锡; Operating Temperature: -25℃~+85℃; Voltage Rating: 50V; Plastic Material: PA9T; Flame Retardant Rating: UL94V-0; Supplementary Features: 辅助焊脚; Color: 白色; Z-Height of the Board: 4.25mm; X-Length of Bottom Edge on Board (Spacing Line): 10.75mm; Y-Width of Bottom Edge on Board: 4.13mm
D3 = SMF24CA_C19077515: 极性:双向;反向截止电压(Vrwm):24V;钳位电压:38.9V;峰值脉冲电流(Ipp):5.1A@10/1000us;峰值脉冲功率(Ppp):200W@10/1000us;击穿电压:29.5V;; LCSC Part Name: 双向TVS 24V截止 峰值浪涌电流：5.1A@10/1000us; Supplier Part: C19077515; Manufacturer: R+O(宏嘉诚); Supplier Footprint: SOD-123FL; JLCPCB Part Class: Extended Part; Datasheet: https://item.szlcsc.com/datasheet/SMF24CA/20275600.html; Supplier: LCSC; Polarity: 双向; Reverse Stand-Off Voltage (Vrwm): 24V; Clamping Voltage: 38.9V; Peak Pulse Current (Ipp): 5.1A@10/1000us; Peak Pulse Power Dissipation (Ppp): 200W@10/1000us; Voltage - Breakdown: 29.5V; Reverse Leakage Current (Ir): 1uA; Operating Temperature: -55℃~+150℃; level of protection: IEC 61000-4-2; Type: TVS
FPC1 = AFC01-S12FCA-00: 锁定特性:翻盖式;触点类型:下接;触点数量:12P;间距:0.5mm;安装方式:卧贴;; LCSC Part Name: 间距:0.5mm P数:12P 翻盖式 下接; Supplier Part: C262661; Manufacturer: JS(钜硕电子); Supplier Footprint: SMD,P=0.5mm,卧贴; JLCPCB Part Class: Extended Part; Datasheet: https://item.szlcsc.com/datasheet/AFC01-S12FCA-00/253920.html; Supplier: LCSC; Locking Feature: 翻盖式; Contact Type: 下接; Number of Contacts: 12P; Pitch: 0.5mm; Mounting Type: 卧贴; FFC, FCB Thickness: 0.3mm; Height Above Board: 2mm
L2 L3 = PCR0630-1R5-M: 电感值:1.5uH;精度:±20%;额定电流:9.5A;饱和电流(Isat):13A;类型:一体成型电感;; LCSC Part Name: 1.5μH ±20% 13A; Supplier Part: C53896870; Manufacturer: JIERR(捷而瑞); Supplier Footprint: SMD,7.5x6.6mm; JLCPCB Part Class: Extended Part; Datasheet: https://item.szlcsc.com/datasheet/PCR0630-1R5-M/57092552.html; Supplier: LCSC; Tolerance: ±20%; Current Rating: 9.5A; Current - Saturation(Isat): 13A; DC Resistance(DCR): 12.5mΩ; Type: 一体成型电感
R40 = FRC0805F1472TS: 电阻类型:厚膜电阻;阻值:14.7kΩ;精度:±1%;功率:125mW;工作电压:150V;温度系数:±100ppm/℃;; LCSC Part Name: 14.7kΩ ±1% 125mW 厚膜电阻; Supplier Part: C2933319; Manufacturer: FOJAN(富捷); Supplier Footprint: 0805; JLCPCB Part Class: Extended Part; Supplier: LCSC; Type: 厚膜电阻; Tolerance: ±1%; Power(Watts): 125mW; Voltage-Supply(Max): 150V; Temperature Coefficient: ±100ppm/℃; Operating Temperature: -55℃~+155℃
R44 R45 = FRC0603J2R0 TS: 电阻类型:厚膜电阻;阻值:2Ω;精度:±5%;功率:100mW;工作电压:75V;温度系数:±200ppm/℃;; LCSC Part Name: 2Ω ±5% 100mW 厚膜电阻; Supplier Part: C2907139; Manufacturer: FOJAN(富捷); Supplier Footprint: 0603; JLCPCB Part Class: Extended Part; Supplier: LCSC; Type: 厚膜电阻; Tolerance: ±5%; Power(Watts): 100mW; Voltage-Supply(Max): 75V; Temperature Coefficient: ±200ppm/℃; Operating Temperature: -55℃~+155℃
R46 = FRC0805J101 TS: 电阻类型:厚膜电阻;阻值:100Ω;精度:±5%;功率:125mW;工作电压:150V;温度系数:±100ppm/℃;; LCSC Part Name: 100Ω ±5% 125mW 厚膜电阻; Supplier Part: C2907294; Manufacturer: FOJAN(富捷); Supplier Footprint: 0805; JLCPCB Part Class: Extended Part; Supplier: LCSC; Type: 厚膜电阻; Tolerance: ±5%; Power(Watts): 125mW; Voltage-Supply(Max): 150V; Temperature Coefficient: ±100ppm/℃; Operating Temperature: -55℃~+155℃
R49 = FRC0603F1372TS: 电阻类型:厚膜电阻;阻值:13.7kΩ;精度:±1%;功率:100mW;工作电压:75V;温度系数:±100ppm/℃;; LCSC Part Name: 13.7kΩ ±1% 100mW 厚膜电阻; Supplier Part: C2930064; Manufacturer: FOJAN(富捷); Supplier Footprint: 0603; JLCPCB Part Class: Extended Part; Supplier: LCSC; Type: 厚膜电阻; Tolerance: ±1%; Power(Watts): 100mW; Voltage-Supply(Max): 75V; Temperature Coefficient: ±100ppm/℃; Operating Temperature: -55℃~+155℃
R50 = HNTC-104F3950FB: 功率:3.5mW;阻值:100kΩ;电阻精度:±1%;B值精度:±1%;B值(25℃/50℃):3950K;最大稳态电流(25℃):-;; Supplier Part: C52204613; Manufacturer: R+O(宏嘉诚); Supplier Footprint: 插件,P=2mm; JLCPCB Part Class: Extended Part; Datasheet: https://item.szlcsc.com/datasheet/HNTC-104F3950FB/55044720.html; Supplier: LCSC; Power(Watts): 3.5mW; Resistance @ 25℃: 100kΩ; Resistance Tolerance: ±1%; B Constant Tolerance: ±1%; B Constant (25℃/50℃): 3950K; Dissipation Factor: 2mW/℃; Thermal Time Constant: 15s; Operating Temperature: -30℃~125℃
R51 = 0603WAF3742T5E: 电阻类型:厚膜电阻;阻值:37.4kΩ;精度:±1%;功率:100mW;工作电压:75V;温度系数:±100ppm/℃;; LCSC Part Name: 37.4kΩ ±1% 100mW 厚膜电阻; Supplier Part: C23033; Manufacturer: UNI-ROYAL(厚声); Supplier Footprint: 0603; JLCPCB Part Class: Extended Part; Datasheet: https://item.szlcsc.com/datasheet/0603WAF3742T5E/23760.html; Supplier: LCSC; Type: 厚膜电阻; Tolerance: ±1%; Power(Watts): 100mW; Voltage-Supply(Max): 75V; Temperature Coefficient: ±100ppm/℃; Operating Temperature: -55℃~+155℃
U9 = CGA0805X5R226M350MT: 容值:22uF;精度:±20%;额定电压:35V;温度系数:X5R;; LCSC Part Name: 22uF ±20% 35V; Supplier Part: C6119901; Manufacturer: HRE(芯声); Supplier Footprint: 0805; JLCPCB Part Class: Extended Part; Datasheet: https://item.szlcsc.com/datasheet/CGA0805X5R226M350MT/7062607.html; Supplier: LCSC; Tolerance: ±20%; Voltage Rating: 35V; Temperature Coefficient: X5R
U10 = SMD1812-200-30: 耐压(Vmax):30V;最大电流(Imax):40A;保持电流(Ihold):2A;跳闸电流(Itrip):4A;; LCSC Part Name: 30V 2A; Supplier Part: C46641168; Manufacturer: R+O(宏嘉诚); Supplier Footprint: 1812; JLCPCB Part Class: Extended Part; Datasheet: https://item.szlcsc.com/datasheet/SMD1812-200-30/48798774.html; Supplier: LCSC; Voltage - Max: 30V; Current - Max: 40A; Hold Current: 2A; Trip Current: 4A; Power Dissipation: 1W; Resistance - Initial (Ri) (Min): 20mΩ; Resistance - Post Trip (R1) (Max): 100mΩ; Time to Trip(Max): 2s; Operating Temperature: -40℃~+85℃; Length: 4.73mm; Width: 3.41mm; Height: 1.5mm
U11 = MP2762AGV-0000-Z: 工作电压:4V~21V;最大充电电流:6A;电池类型:-;电池节数:2;; LCSC Part Name: I2C控制的6A降压或升压充电器，适用于两节串联电池应用，具备NVDC电源管理和USB OTG功能; Supplier Part: C26697965; Manufacturer: MPS(芯源); Supplier Footprint: QFN-30(4x5); JLCPCB Part Class: Extended Part; Datasheet: https://item.szlcsc.com/datasheet/MP2762AGV-0000-Z/28436284.html; Supplier: LCSC; The Chip Type: 充电芯片; Voltage - Supply: 4V~21V; Charge Current - Max: 6A; Charging Saturation Voltage: 8.4V; Number of Cells: 2; Operating Temperature: -40℃~+125℃; Battery Temperature Detection: 支持; 0V Battery Charge: 支持; Supply Current (Iq): 40uA; Interface: I2C
U12 = RE2512F3R010: 电阻类型:采样电阻；合金电阻;阻值:10mΩ;精度:±1%;功率:3W;温度系数:±50ppm/℃;; LCSC Part Name: 10mΩ 3W 2512 ±1%; Supplier Part: C46961753; Manufacturer: JIERR(捷而瑞); Supplier Footprint: 2512; JLCPCB Part Class: Extended Part; Datasheet: https://item.szlcsc.com/datasheet/RE2512F3R010/49133292.html; Supplier: LCSC; Type: 采样电阻；合金电阻; Tolerance: ±1%; Power(Watts): 3W; Temperature Coefficient: ±50ppm/℃
U13 = BX-GH1.25-4PWT: 插针结构:1x4P;间距:1.25mm;安装方式:卧贴;参考系列:GH;总PIN数:4P;排数:1;每排PIN数:4;行距:-;额定电流:1A;触头材质:磷铜;触头镀层:锡;工作温度:-25℃~+85℃;; LCSC Part Name: 1x4P 间距:1.25mm 卧贴 系列:GH; Supplier Part: C18077720; Manufacturer: Bossie(博锡); Supplier Footprint: SMD,P=1.25mm,卧贴; JLCPCB Part Class: Extended Part; Datasheet: https://item.szlcsc.com/datasheet/BX-GH1.25-4PWT/19218121.html; Supplier: LCSC; Pins Structure: 1x4P; Pitch: 1.25mm; Mounting Type: 卧贴; Reference Series: GH; Number of Pins: 4P; Number of Rows: 1; Number of PINs Per Row: 4; Current Rating: 1A; Contact Material: 磷铜; Contact Plating: 锡; Operating Temperature: -25℃~+85℃; Voltage Rating: 125V; Plastic Material: LCP; Supplementary Features: 辅助焊脚; Color: 米色; Z-Height of the Board: 4.35mm; X-Length of Bottom Edge on Board (Spacing Line): 8.25mm; Y-Width of Bottom Edge on Board: 5mm
U14 = 2S均衡保护板

## Nets
8.4V: CN3.1 CN3.2 U14.1
GND: C1.2 C2.2 C3.1 C4.1 C5.2 C6.2 C7.2 C8.1 C9.1 C10.1 C11.2 C12.2 C13.2 C14.2 C15.1 C16.1 C17.1 C18.2 C19.2 C21.1 C22.2 C23.1 C24.1 C25.1 C26.2 C27.2 C28.1 C29.2 C30.2 C31.2 C33.1 C34.2 C35.1 C36.2 C37.2 C38.1 C43.1 C44.1 C45.1 C46.1 C47.1 C48.2 C75.2 CN1.4 CN1.5 CN2.4 CN2.5 CN3.7 CN3.8 D1.2 D2.2 D3.2(A) FPC1.10 FPC1.12 FPC1.13 FPC1.14 H1.4 LDO1.2(VSS) LDO2.2(VSS) LED2.1(K) R1.2 R3.2 R14.1 R15.1 R17.1 R19.1 R22.1 R23.1 R33.1 R34.1 R38.1 R40.1 R46.1 R48.2 R50.2 R51.2 R71.1 R72.2 SW1.1 U1.15(VSS) U1.27(VSSA) U1.31(VSS) U1.47(VSS) U1.63(VSS) U2.6 U2.7 U2.8 U3.1 U3.5 U3.6 U4.1 U4.5 U4.6 U5.3(GND) U5.6(GNE) U5.15(GND) U5.25(PAD) U6.3(GND) U6.6(GNE) U6.15(GND) U6.25(PAD) U7.10(GND) U7.25(EP) U8.3(A) U9.2 U11.4(PGND) U11.19(PGND) U11.27(AGND) U13.3 U13.4 U13.5 U13.6 U14.5 USB2.1 USB2.2 USB2.3 USB2.4 USB2.A1B12(GND) USB2.B1A12(GND) X1.2(GND) X1.4(GND) ; also on sheet 5
VBUS: C29.1 D1.1 Q1.1(S) Q1.2(S) Q1.3(S) R26.2 R27.2 U7.24(VDD) USB2.A4B9(VBUS) USB2.B4A9(VBUS)
VCC: C1.1 C2.1 C5.1 C6.1 C7.1 C11.1 C12.1 C15.2 C16.2 H1.5 L1.2 R4.1 R8.2 R9.2 R10.2 R11.2 R31.2 R32.2 R33.3 R34.3 R35.2 R36.2 R37.2 U1.1(VBAT) U1.16(VDD) U1.28(VREF+) U1.29(VDDA) U1.32(VDD) U1.48(VDD) U1.64(VDD) U3.4 U4.4 U7.22(VSYS) ; also on sheet 5
12_SYS: C21.2 C22.1 C23.2 C75.1 U5.9(VS) U5.10(VS) U6.9(VS) U6.10(VS) ; also on sheet 5
ADAPTER_IN: C37.1 R44.1 U10.2 U12.1
ATTACH: LED1.1(K) U7.11(ATTACH)
BASE_DET: FPC1.8 ; also on sheet 5
BAT_VCC: D3.1(K) U10.1 ; also on sheet 5
BATT: C33.2 C35.2 U11.7(BATT) U11.16(BATT) U14.4
BOOT0_CTRL: BOOT0.1 R1.1 U1.61(PB8-BOOT0) U2.5
BST1: C39.1 U11.23(BST1)
BST2: C40.1 U11.24(BST2)
BST3: C42.1 U11.15(BST3)
BT: CN3.5 CN3.6 U14.3
CHG_ACOK_N: FPC1.5 R47.1 U11.28(ACOK#)
CHG_INT_N: FPC1.4 R43.1 U11.9(INT#)
CHG_OTG_EN: FPC1.7 R48.1 U11.5(OTG)
CHG_PROCHOT_N: FPC1.6 R39.2 U11.8(PROCHOT#)
DAC1_OUT1: R16.1 U1.18(PA4)
DAC1_OUT2: R77.1 U1.19(PA5)
DISCH: R28.1 U7.9(DISCH)
EN_X: R13.1 R74.1 U5.17(EN\FAULT)
EN_Y: R12.1 R73.1 U6.17(EN\FAULT)
FOC_3.3V: C27.1 LDO2.5(VOUT) R12.2 R13.2 R20.2 R21.2 R39.1 R43.2 R47.2
G431_ENABLE_IN: R3.1 R5.2 U1.55(PD2)
G431_FAULT_OUT: R4.2 U1.54(PC12) U2.4
G431_UART_RX: R6.2 U1.53(PC11)
G431_UART_TX: R7.2 U1.52(PC10)
I2C1_SCL: R10.1 U1.51(PA15) U3.2
I2C1_SDA: R8.1 U1.60(PB7) U3.3
I2C2_SCL: R11.1 U1.30(PB10) U4.2
I2C2_SDA: R9.1 U1.33(PB11) U4.3
I2C_ADDR0: R33.2 U7.12(ADDR0)
I2C_ADDR1: R34.2 U7.13(ADDR1)
I2C_INT: FPC1.3 R35.1 U7.19(ALERT)
IAN: C41.1 R45.2 U11.30(IAN)
IAP: C41.2 R44.2 U11.29(IAP)
IN: C34.1 R45.1 U9.1 U11.1(IN) U11.22(IN) U12.2
IX: C24.2 R24.2 U1.13(PA1)
IY: C25.2 R25.2 U1.14(PA2)
M1_INUH: U1.42(PA8) U5.19(INU\NUH)
M1_INUL: U1.35(PB13) U5.20(ENU\INUL)
M1_INVH: U1.43(PA9) U5.21(INV\NVH)
M1_INVL: U1.36(PB14) U5.22(ENV\INVL)
M1_INWH: U1.44(PA10) U5.23(INW\INWH)
M1_INWL: U1.37(PB15) U5.24(ENW\INWL)
M2_INUH: U1.38(PC6) U6.19(INU\NUH)
M2_INUL: U1.21(PA7) U6.20(ENU\INUL)
M2_INVH: U1.39(PC7) U6.21(INV\NVH)
M2_INVL: U1.24(PB0) U6.22(ENV\INVL)
M2_INWH: U1.40(PC8) U6.23(INW\INWH)
M2_INWL: U1.25(PB1) U6.24(ENW\INWL)
MCU_5V: C13.1 C17.2 C26.1 C28.2 LDO1.1(VIN) LDO1.3(CE) LDO2.1(VIN) LDO2.3(CE) ; also on sheet 5
NET13: R40.2 U11.12(PSYS)
NRST: C10.2 H1.3 SW1.2 U1.7(PG10-NRST)
NTC: R49.2 R50.1 R51.1 U11.3(NTC)
OSC32_IN: C8.2 U1.3(PC14-OSC32_IN) X2.2
OSC32_OUT: C9.2 U1.4(PC15-OSC32_OUT) X2.1
OSC_IN: C3.2 U1.5(PF0-OSC_IN) X1.3
OSC_OUT: C4.2 U1.6(PF1-OSC_OUT) X1.1
OV: CN3.3 CN3.4 U14.2
PC2: U1.10(PC2) ; also on sheet 5
POK2: U7.20(POWER_OK2)
POK3: U7.14(POWER_OK3)
PWR_I2C4_SCL: FPC1.1 R36.1 SCL.1 U7.7(SCL) U11.11(SCL)
PWR_I2C4_SDA: FPC1.2 R37.1 SDA.1 U7.8(SDA) U11.10(SDA)
RST: R38.2 U7.6(RESET)
SNS_X: R24.1 R71.2 U5.4(SNS) U5.5(SENSEU) U5.13(SENSEV) U5.14(SENSEW)
SNS_Y: R25.1 R72.1 U6.4(SNS) U6.5(SENSEU) U6.13(SENSEV) U6.14(SENSEW)
STBY_X: R22.2 U1.8(PC0) U5.16(STBY\RESET)
STBY_Y: R23.2 U1.9(PC1) U6.16(STBY\RESET)
SW1: C39.2 L2.1 U11.21(SW1)
SW2: C40.2 L2.2 L3.1 U11.20(SW2)
SW3: C42.2 L3.2 U11.18(SW3)
SWCLK: H1.2 U1.50(PA14)
SWDIO: H1.1 U1.49(PA13)
SYS: C43.2 C44.2 C45.2 C46.2 C47.2 C48.1 U11.6(SYS) U11.17(SYS) U13.1 U13.2 ; also on sheet 5
U_X: CN1.1 U5.7(OUTU)
U_Y: CN2.1 U6.7(OUTU)
USB_CC1: ?#2.0 ?#4.0 U7.1(CC1DB) U7.2(CC1) U8.1(K) USB2.A5(CC1)
USB_CC2: ?#1.0 ?#3.0 U7.4(CC2) U7.5(CC2DB) U8.2(K) USB2.B5(CC2)
V_X: CN1.2 U5.11(OUTV)
V_Y: CN2.2 U6.11(OUTV)
VNTC: R49.1 U11.2(VNTC)
VSINK: C32.2 D2.1 Q1.5(D) Q1.6(D) Q1.7(D) Q1.8(D) Q1.9(D) R28.2 ; also on sheet 5
VUBS_DISCH: R26.1 U7.18(VBUS_VS_DISCH)
VUBS_EN_SINK: R30.1 U7.16(VBUS_EN_SNK)
W_X: CN1.3 U5.12(OUTW)
W_Y: CN2.3 U6.12(OUTW)
$1N17: C14.1 L1.1 LDO1.5(VOUT)
$1N249: R7.1 U2.1
$1N250: R6.1 U2.2
$1N251: R5.1 U2.3
$1N261: R73.2 U1.12(PA0)
$1N263: R74.2 U1.20(PA6)
$2N83: R17.2 U5.2(TOFF)
$2N84: R19.2 U6.2(TOFF)
$2N91: R20.1 U5.18(MODE)
$2N94: R21.1 U6.18(MODE)
$2N117: C18.1 R14.2 R16.2 U5.1(REF)
$2N120: C19.1 R15.2 R77.2 U6.1(REF)
$3N13: LED2.2(A) R32.1
$3N18: Q1.4(G) R27.1 R29.2 R30.2
$3N21: C32.1 R29.1
$3N24: LED1.2(A) R31.1
$3N63: C31.1 U7.21(VREG_1V2)
$3N64: C30.1 U7.23(VREG_2V7)
$4N1: IBM1.1 U11.13(IBM)
$4N2: IAM1.1 U11.14(IAM)
$4N4: C38.2 R46.2 U11.25(VMAX_BST)
$4N24: C36.1 U11.26(VCC)

Not connected (* = marked no-connect by the designer): FPC1 9* 11*; LDO1 4(NC)*; LDO2 4(NC)*; U1 2(PC13)* 11(PC3)* 17(PA3)* 22(PC4)* 23(PC5)* 26(PB2)* 34(PB12)* 41(PC9)* 45(PA11)* 46(PA12)* 56(PB3)* 57(PB4)* 58(PB5)* 59(PB6)* 62(PB9)*; U5 8(NC)*; U6 8(NC)*; U7 3(NC)* 15(GPIO)* 17(A_B_SIDE)*; USB2 A6(DP1)* A7(DN1)* A8(SBU1)* B6(DP2)* B7(DN2)* B8(SBU2)*

## Notes on the sheets
sheet 1
- 滤波
- HSE
- stm32g431最小系统
- 磁珠600Ω 100mhz 0603
  抑制高频噪声
- LDO稳压模块
- ADC基准噪声抑制
sheet 2
- LDO稳压模块
sheet 3
- STUSB4500 type-c DP取电
sheet 4
- 这三颗必须非常靠近
  芯片引脚放置，不能绕远
- U13：2S均衡保护板
  1：8.4V
  2：电池负极
  3：4.2V均衡
  4：p+
  5：P-
